# Altium project IDC_Tester_v1.PrjPcb (part 1 of 3)
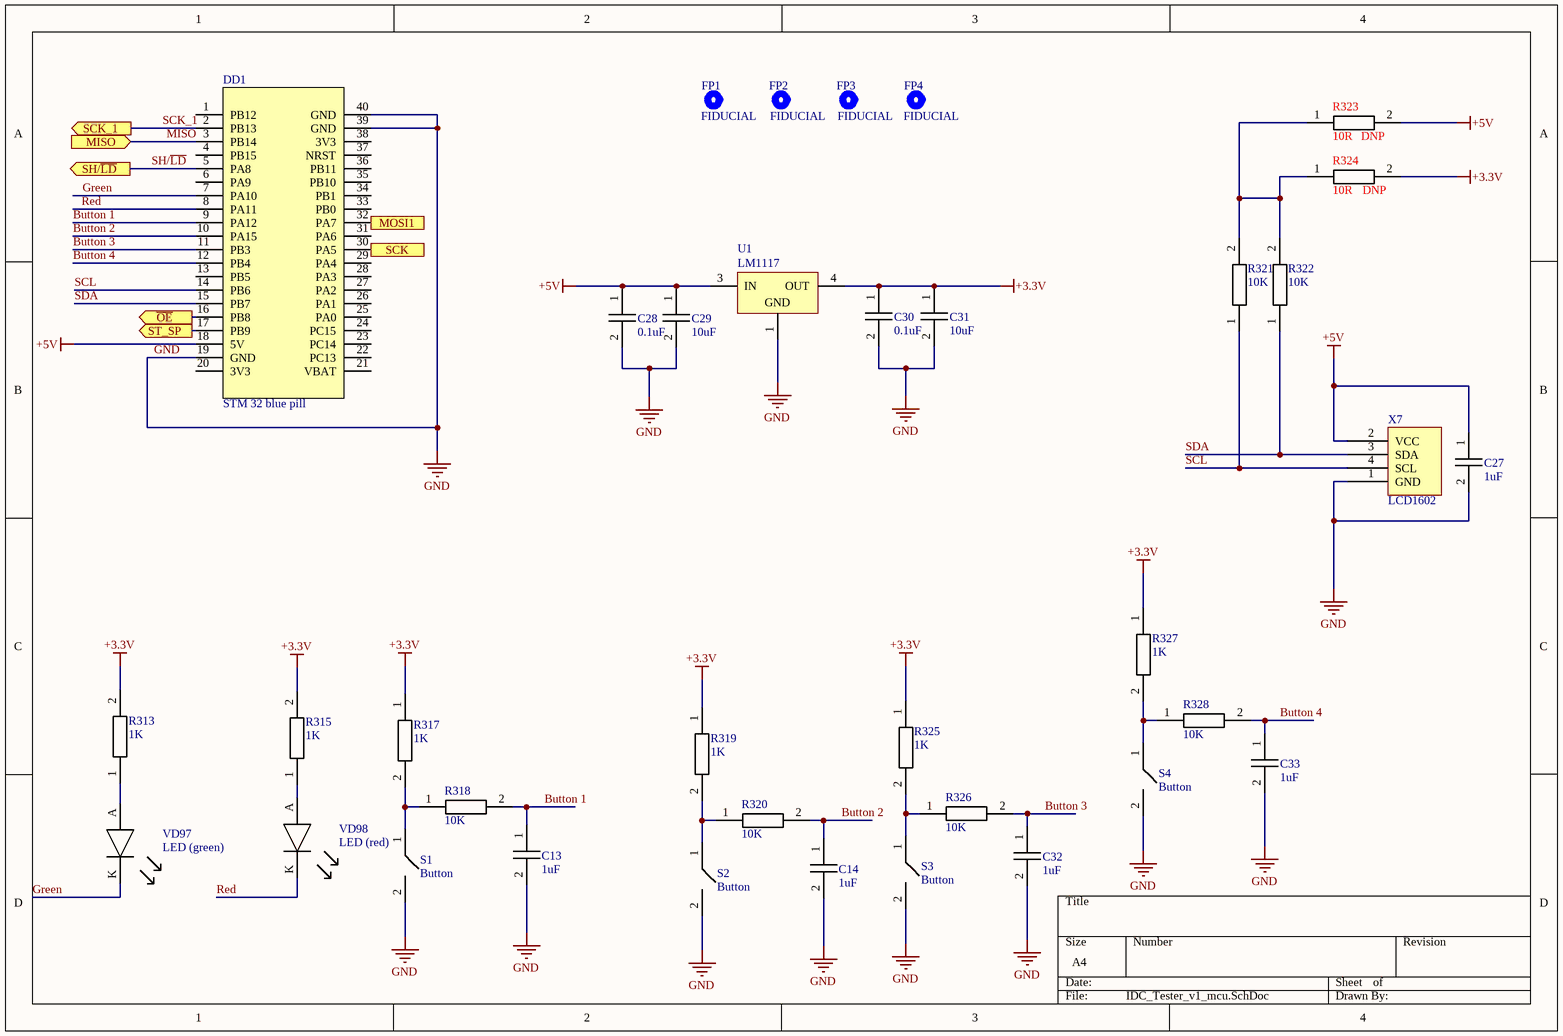
[diagram p0: IDC_Tester_v1_mcu.SchDoc]
10 sheets, 594 parts. Net scope: flat (ports and power ports of the same name join across sheets).
Board file: IDC_Tester_v1.PcbDoc
Sheets:
  IDC_Tester_v1_mcu.SchDoc
  IDC_Tester_v1_sift_register_output.SchDoc
  IDC_Tester_v1_connector.SchDoc
  IDC_Tester_v1_LED.SchDoc
  IDC_Tester_v1_LED_2.SchDoc
  IDC_Tester_v1_LED_3.SchDoc
  IDC_Tester_v1_LED_4.SchDoc
  IDC_Tester_v1_LED_5.SchDoc
  IDC_Tester_v1_LED_6.SchDoc
  IDC_Tester_v1_sift_register_input.SchDoc

## Sheet IDC_Tester_v1_mcu.SchDoc
size A4; SheetNumber: 1; SheetTotal: 10

### Parts
C13  1uF  [Capacitor 0603]
C14  1uF  [Capacitor 0603]
C27  1uF  [Capacitor 0603]
C28  0.1uF  [Capacitor 0603]
C29  10uF  [Capacitor 0603]
C30  0.1uF  [Capacitor 0603]
C31  10uF  [Capacitor 0603]
C32  1uF  [Capacitor 0603]
C33  1uF  [Capacitor 0603]
DD1  STM 32 blue pill  [STM32 blue pill]
FP1  FIDUCIAL  [FIDICIAL POINT - R0.3]
FP2  FIDUCIAL  [FIDICIAL POINT - R0.3]
FP3  FIDUCIAL  [FIDICIAL POINT - R0.3]
FP4  FIDUCIAL  [FIDICIAL POINT - R0.3]
R313  1K  [Resistor 0603]
R315  1K  [Resistor 0603]
R317  1K  [Resistor 0603]
R318  10K  [Resistor 0603]
R319  1K  [Resistor 0603]
R320  10K  [Resistor 0603]
R321  10K  [Resistor 0603]
R322  10K  [Resistor 0603]
R323  10R  Mount: DNP  [Resistor 0603]
R324  10R  Mount: DNP  [Resistor 0603]
R325  1K  [Resistor 0603]
R326  10K  [Resistor 0603]
R327  1K  [Resistor 0603]
R328  10K  [Resistor 0603]
S1  Button  [Button]
S2  Button  [Button]
S3  Button  [Button]
S4  Button  [Button]
U1  LM1117  [TO-252]
VD97  LED (green)  [Led 0603 green]
VD98  LED (red)  [Led 0603 RED]
X7  LCD1602  [LCD1602]

### Ports
MISO (in), MOSI1 (out), SCK (out), SCK_1 (out), SH/~{LD} (out), ST_SP (out), ~{OE} (out)

### Nets
+3.3V: C30.1 C31.1 R313.2 R315.2 R317.1 R319.1 R324.2 R325.1 R327.1 U1.4(OUT)
+5V: C27.1 C28.1 C29.1 DD1.18(5V) R323.2 U1.3(IN) X7.2(VCC)
GND: C13.2 C14.2 C27.2 C28.2 C29.2 C30.2 C31.2 C32.2 C33.2 DD1.19(GND) DD1.39(GND) DD1.40(GND) S1.2 S2.2 S3.2 S4.2 U1.1(GND) X7.1(GND)
Button 1: C13.1 DD1.9(PA12) R318.2
Button 2: C14.1 DD1.10(PA15) R320.2
Button 3: C32.1 DD1.11(PB3) R326.2
Button 4: C33.1 DD1.12(PB4) R328.2
Green: DD1.7(PA10) VD97.K
MISO: DD1.3(PB14) ; port MISO
MOSI 1: DD1.32(PA7) ; port MOSI1
~{OE}: DD1.16(PB8) ; port ~{OE}
Red: DD1.8(PA11) VD98.K
SCK: DD1.30(PA5) ; port SCK
SCK_1: DD1.2(PB13) ; port SCK_1
SCL: DD1.14(PB6) R321.1 X7.4(SCL)
SDA: DD1.15(PB7) R322.1 X7.3(SDA)
SH/~{LD}: DD1.5(PA8) ; port SH/~{LD}
ST_CP: DD1.17(PB9) ; port ST_SP
NetR313_1: R313.1 VD97.A
NetR315_1: R315.1 VD98.A
NetR317_2: R317.2 R318.1 S1.1
NetR319_2: R319.2 R320.1 S2.1
NetR321_2: R321.2 R322.2 R323.1 R324.1
NetR325_2: R325.2 R326.1 S3.1
NetR327_2: R327.2 R328.1 S4.1

Not connected (* = marked no-connect by the designer): DD1 1(PB12) 4(PB15) 6(PA9) 13(PB5) 20(3V3) 21(VBAT) 22(PC13) 23(PC14) 24(PC15) 25(PA0) 26(PA1) 27(PA2) 28(PA3) 29(PA4) 31(PA6) 33(PB0) 34(PB1) 35(PB10) 36(PB11) 37(NRST) 38(3V3)

### Library data of the parts
C13 C14 C27 C32 C33 = Capacitor: Part Number: SMD CAP CER 1UF 25V X5R 0603 (CC0603KRX5R8BB105); Added by: viskov2055@gmail.com; Mount_Type: SMD; Solder_Amount: 2; Pkg: 0603; Created at: 16/02/2024; Mount: MOUNT
C28 C30 = C0603_2: Capacitor SMD 0603; Part Number: CAP CER 0603 0.1uF 16V 10%; Added_by: ridel_av@teslatec.ru; Solder_Amount: 2; Pkg: 0603; Mount: MOUNT; MountType: SMD
C29 C31 = C0603_3: Capacitor SMD 0603; Part Number: CAP CER 0603 10uF 16V 10%; Added_by: ridel_av@teslatec.ru; Solder_Amount: 2; Pkg: 0603; Mount: MOUNT; MountType: SMD
DD1 = STM 32 blue pill: Part Number: STM32F103C8T6 (blue pill); Added by: viskov2055@gmail.com; Mount_Type: THM; Solder_Amount: 40; Pkg: PBS-40 (STM32 blue pill); Created at: 13/02/2024; Mount: MOUNT
FP1-FP4 = FIDUCIAL_R0.3: Adder_by: ridel_av@teslatec.ru; Solder_Amount: -; Pkg: -; Created_at: 22/03/2020; Mount: -; MountType: -
R313 R315 R317 R319 R325 R327 = Resistor 1K: Part Number: SMD RES 1K OHM 1%±100ppm/°C 0603 (RMCF0603FT1K00); Added by: viskov2055@gmail.com; Mount_Type: SMD; Solder_Amount: 2; Pkg: 0603; Created at: 13/02/2024; Mount: MOUNT
R318 R320-R322 R326 R328 = Resistor 10K: Part Number: SMD RES 10K OHM 1%±100ppm/°C 0603 (RMCF0603FT10K0); Added by: viskov2055@gmail.com; Mount_Type: SMD; Solder_Amount: 2; Pkg: 0603; Created at: 15/02/2024; Mount: MOUNT
R323 R324 = Resistor 10R: Part Number: SMD RES 10 OHM 1% ±100ppm/°C 0603 (RMCF0603FT10R); Added by: viskov2055@gmail.com; Mount_Type: SMD; Solder_Amount: 2; Pkg: 0603; Created at: 19/02/2024
S1-S4 = Button: Part Number: PTS645SM43SMTR92LFS; Added by: viskov2055@gmail.com; Mpunt_Type: SMD; Solder_Amount: 4; Created at: 19/02/2024; Mount: MOUNT; Pkg: Button
U1 = LM1117DT-3.3/NOPB: 800mA Low-Dropout Linear Regulator, 3-pin TO-252, Pb-Free; Added_by: ridel_av@teslatec.ru; Solder_Amount: 3; Pkg: TD03B_N; Mount: MOUNT; MountType: SMD; Part Number: LM1117DT-3.3/NOPB
VD97 = LED: LED Uni-Color Green 515nm 2-Pin SMD T/R; Manufacturer: Kingbright; Manufacturer Part Number: APG1608ZGCK; Lens Style: Flat; Lens Transparency: Clear; Luminous Intensity: 400mcd; Forward Voltage: 3.3V; Test Current: 20mA; Viewing Angle: 130°; Dominant Wavelength: 525nm; Lens Size: 0.8mm; Added by: viskov2055@gmail.com; Solder_Amount: 2; Pkg: 0603; RoHS: Yes; Category: LEDs; Stock 1: 44996; Pricing 1: 1=0,6, 10=0,368, 100=0,2114, 1000=0,16544, 2000=0,15165 (USD); MountType: SMD; Case/Package: 0603; Color: Green; Case Code (Imperial): 0603; Case Code (Metric): 1608; Packaging: Tape and Reel; Length: 1.6mm; Width: 0.8mm; Height: 0.28mm; RoHS Compliant: Yes; ComponentLink1URL: https://datasheet.octopart.com/APG1608ZGCK-Kingbright-datasheet-153682089.pdf?src-supplier=Future+Electronics; ComponentLink1Description: https://datasheet.octopart.com/APG1608ZGCK-Kingbright-datasheet-153682089.pdf?src-supplier=Future+Electronics; ComponentLink2URL: http://www.kingbrightusa.com/images/catalog/SPEC/APG1608ZGCK.pdf?src-supplier=Digikey; ComponentLink2Description: http://www.kingbrightusa.com/images/catalog/SPEC/APG1608ZGCK.pdf?src-supplier=Digikey; ComponentLink3URL: https://datasheet.octopart.com/APG1608ZGCK-Kingbright-datasheet-137408059.pdf?src-supplier=Sager+Electronics; ComponentLink3Description: https://datasheet.octopart.com/APG1608ZGCK-Kingbright-datasheet-137408059.pdf?src-supplier=Sager+Electronics; Supplier Part Number 1: 754-2113-1-ND; Created at: 13/02/2024; Mount: MOUNT; Part Number: APG1608ZGCK; Supplier 1: Digikey
VD98 = LED (red): Part Number: APT1608SURCK; Added by: viskov2055@gmail.com; Solder_Amount: 2; Pkg: 0603; Mount_Type: SMD; Created at: 13/02/2024; Mount: MOUNT
X7 = LCD1602: Part Number: LCD1602I2C (green light); Added by: viskov2055@gmail.com; Mount_Type: THM; Solder_Amount: 4; Pkg: board (connector); Created at: 19/02/2024; Mount: MOUNT

## Sheet IDC_Tester_v1_sift_register_output.SchDoc
size 420 x 297 mm; SheetNumber: 2; SheetTotal: 10
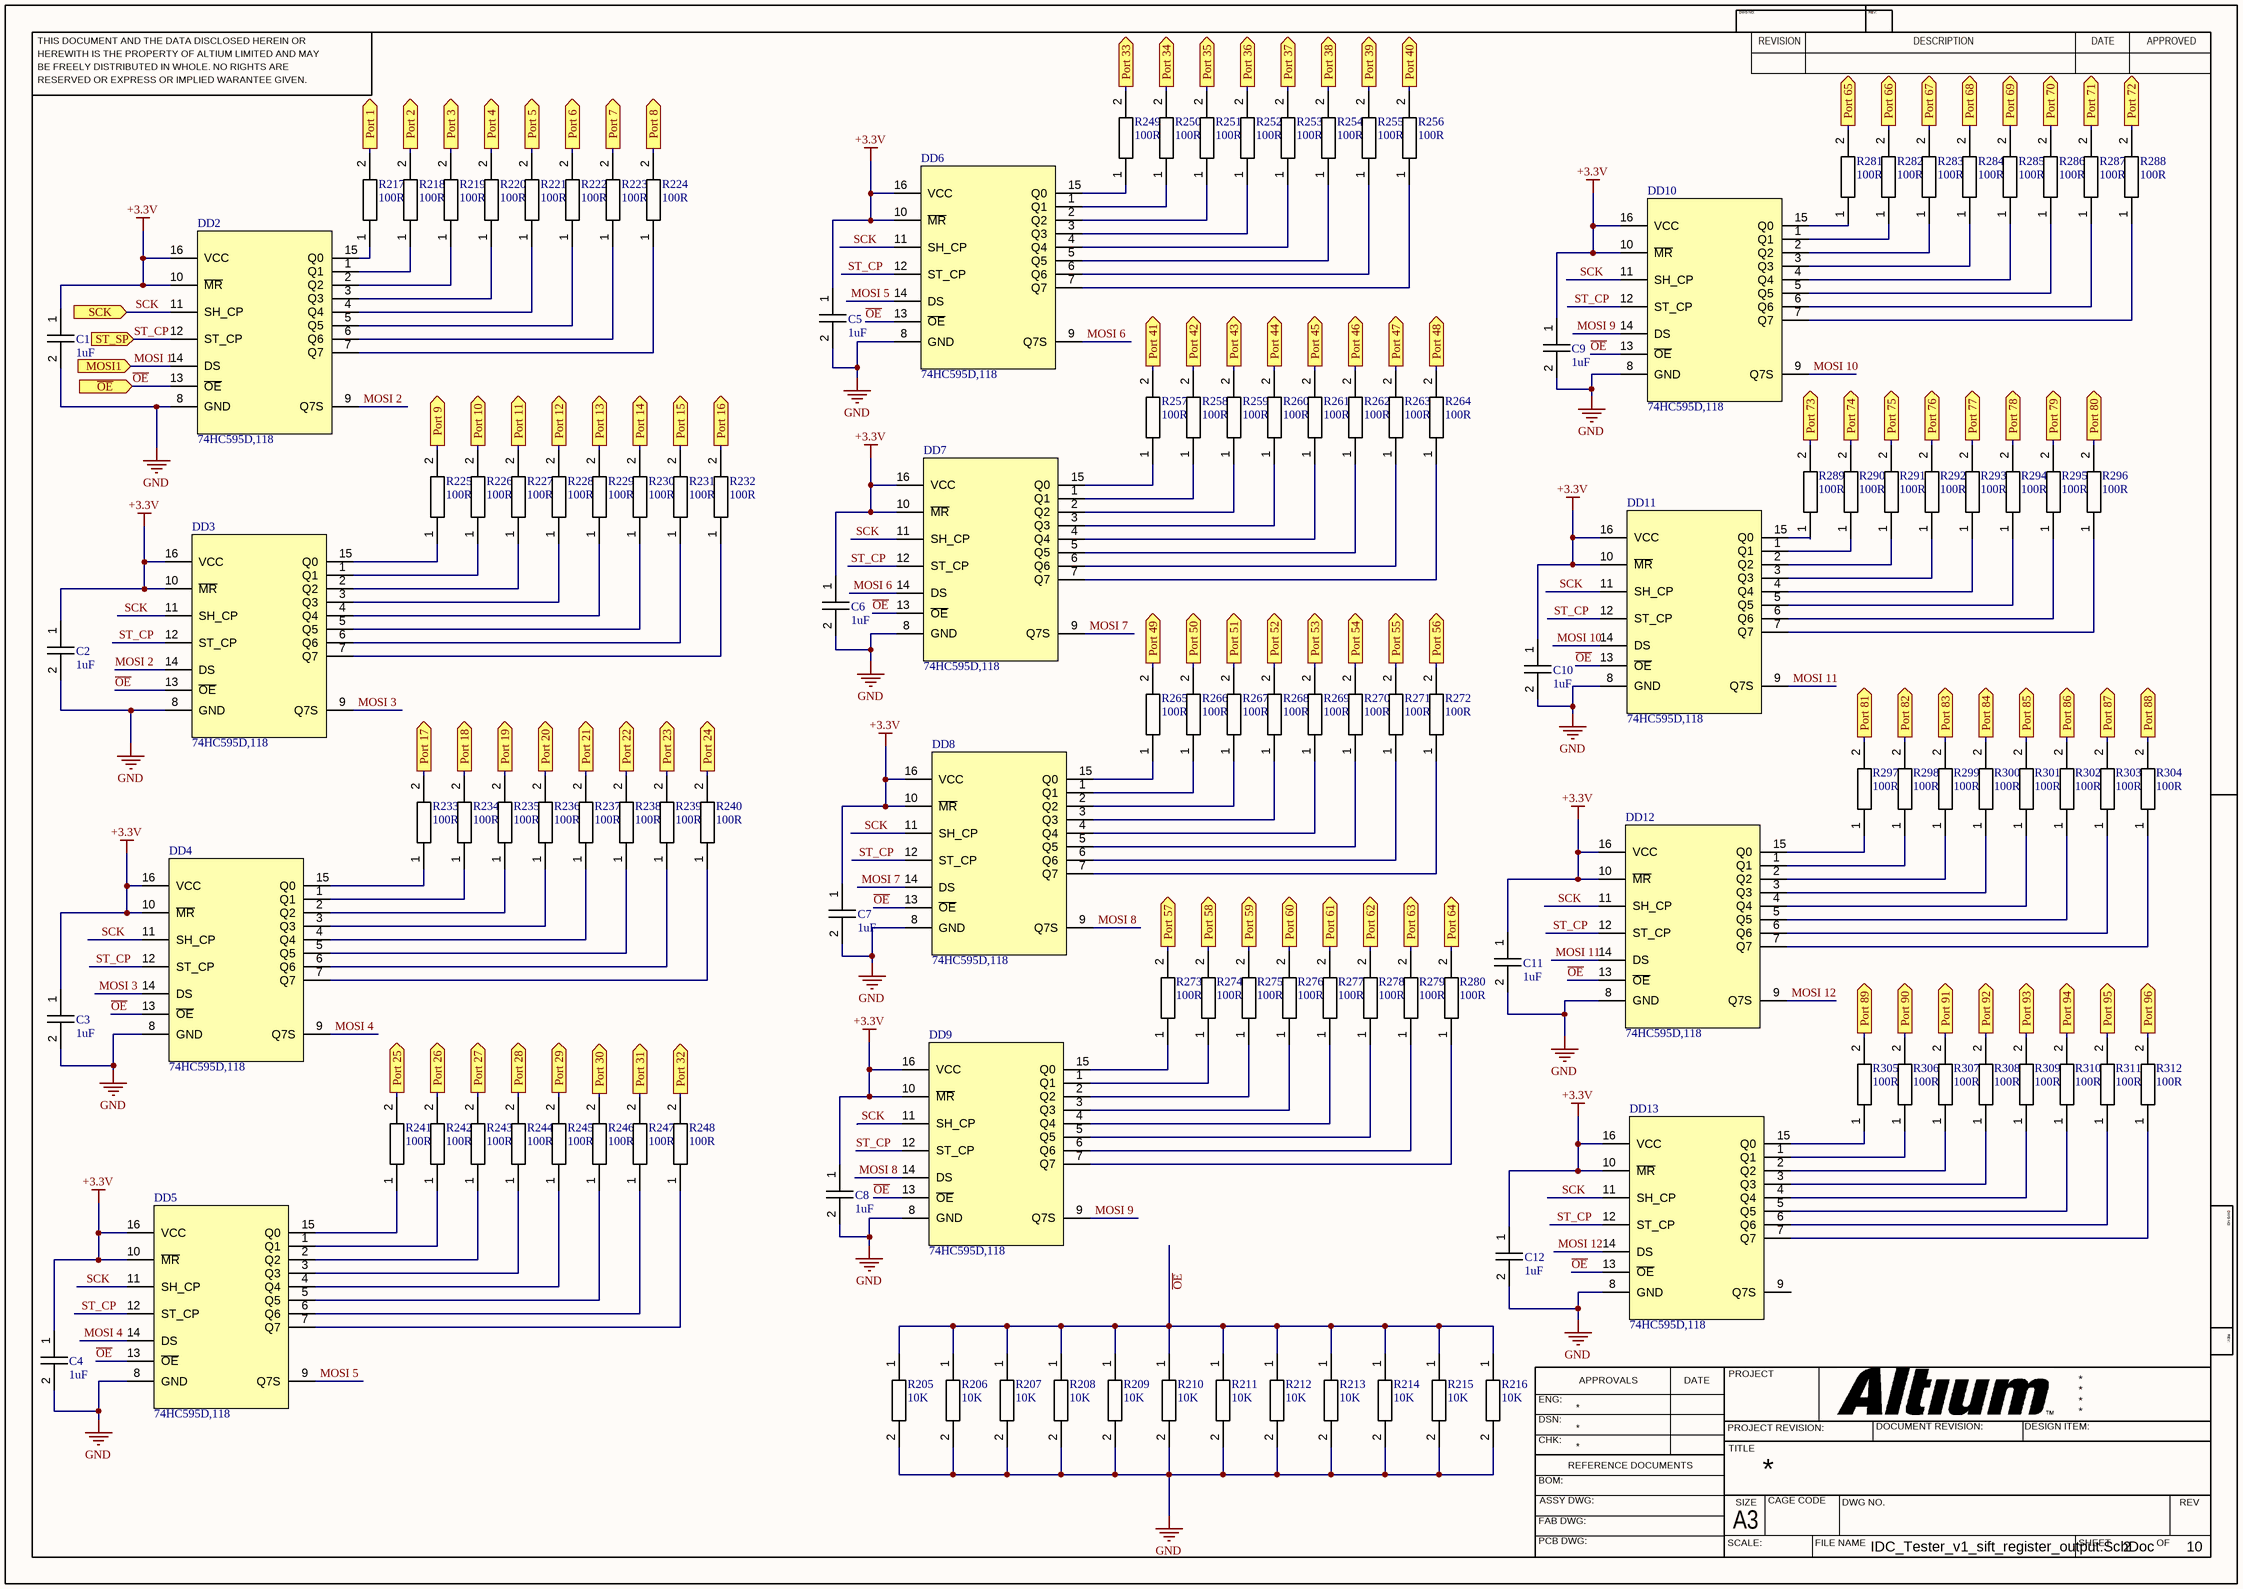
[diagram p1: IDC_Tester_v1_sift_register_output.SchDoc]

### Parts
C1  1uF  [Capacitor 0603]
C2  1uF  [Capacitor 0603]
C3  1uF  [Capacitor 0603]
C4  1uF  [Capacitor 0603]
C5  1uF  [Capacitor 0603]
C6  1uF  [Capacitor 0603]
C7  1uF  [Capacitor 0603]
C8  1uF  [Capacitor 0603]
C9  1uF  [Capacitor 0603]
C10  1uF  [Capacitor 0603]
C11  1uF  [Capacitor 0603]
C12  1uF  [Capacitor 0603]
DD2  74HC595D,118  [Shift register 74HC165 or 74HC595]
DD3  74HC595D,118  [Shift register 74HC165 or 74HC595]
DD4  74HC595D,118  [Shift register 74HC165 or 74HC595]
DD5  74HC595D,118  [Shift register 74HC165 or 74HC595]
DD6  74HC595D,118  [Shift register 74HC165 or 74HC595]
DD7  74HC595D,118  [Shift register 74HC165 or 74HC595]
DD8  74HC595D,118  [Shift register 74HC165 or 74HC595]
DD9  74HC595D,118  [Shift register 74HC165 or 74HC595]
DD10  74HC595D,118  [Shift register 74HC165 or 74HC595]
DD11  74HC595D,118  [Shift register 74HC165 or 74HC595]
DD12  74HC595D,118  [Shift register 74HC165 or 74HC595]
DD13  74HC595D,118  [Shift register 74HC165 or 74HC595]
R205  10K  [Resistor 0603]
R206  10K  [Resistor 0603]
R207  10K  [Resistor 0603]
R208  10K  [Resistor 0603]
R209  10K  [Resistor 0603]
R210  10K  [Resistor 0603]
R211  10K  [Resistor 0603]
R212  10K  [Resistor 0603]
R213  10K  [Resistor 0603]
R214  10K  [Resistor 0603]
R215  10K  [Resistor 0603]
R216  10K  [Resistor 0603]
R217  100R  [Resistor 0603]
R218  100R  [Resistor 0603]
R219  100R  [Resistor 0603]
R220  100R  [Resistor 0603]
R221  100R  [Resistor 0603]
R222  100R  [Resistor 0603]
R223  100R  [Resistor 0603]
R224  100R  [Resistor 0603]
R225  100R  [Resistor 0603]
R226  100R  [Resistor 0603]
R227  100R  [Resistor 0603]
R228  100R  [Resistor 0603]
R229  100R  [Resistor 0603]
R230  100R  [Resistor 0603]
R231  100R  [Resistor 0603]
R232  100R  [Resistor 0603]
R233  100R  [Resistor 0603]
R234  100R  [Resistor 0603]
R235  100R  [Resistor 0603]
R236  100R  [Resistor 0603]
R237  100R  [Resistor 0603]
R238  100R  [Resistor 0603]
R239  100R  [Resistor 0603]
R240  100R  [Resistor 0603]
R241  100R  [Resistor 0603]
R242  100R  [Resistor 0603]
R243  100R  [Resistor 0603]
R244  100R  [Resistor 0603]
R245  100R  [Resistor 0603]
R246  100R  [Resistor 0603]
R247  100R  [Resistor 0603]
R248  100R  [Resistor 0603]
R249  100R  [Resistor 0603]
R250  100R  [Resistor 0603]
R251  100R  [Resistor 0603]
R252  100R  [Resistor 0603]
R253  100R  [Resistor 0603]
R254  100R  [Resistor 0603]
R255  100R  [Resistor 0603]
R256  100R  [Resistor 0603]
R257  100R  [Resistor 0603]
R258  100R  [Resistor 0603]
R259  100R  [Resistor 0603]
R260  100R  [Resistor 0603]
R261  100R  [Resistor 0603]
R262  100R  [Resistor 0603]
R263  100R  [Resistor 0603]
R264  100R  [Resistor 0603]
R265  100R  [Resistor 0603]
R266  100R  [Resistor 0603]
R267  100R  [Resistor 0603]
R268  100R  [Resistor 0603]
R269  100R  [Resistor 0603]
R270  100R  [Resistor 0603]
R271  100R  [Resistor 0603]
R272  100R  [Resistor 0603]
R273  100R  [Resistor 0603]
R274  100R  [Resistor 0603]
R275  100R  [Resistor 0603]
R276  100R  [Resistor 0603]
R277  100R  [Resistor 0603]
R278  100R  [Resistor 0603]
R279  100R  [Resistor 0603]
R280  100R  [Resistor 0603]
R281  100R  [Resistor 0603]
R282  100R  [Resistor 0603]
R283  100R  [Resistor 0603]
R284  100R  [Resistor 0603]
R285  100R  [Resistor 0603]
R286  100R  [Resistor 0603]
R287  100R  [Resistor 0603]
R288  100R  [Resistor 0603]
R289  100R  [Resistor 0603]
R290  100R  [Resistor 0603]
R291  100R  [Resistor 0603]
R292  100R  [Resistor 0603]
R293  100R  [Resistor 0603]
R294  100R  [Resistor 0603]
R295  100R  [Resistor 0603]
R296  100R  [Resistor 0603]
R297  100R  [Resistor 0603]
R298  100R  [Resistor 0603]
R299  100R  [Resistor 0603]
R300  100R  [Resistor 0603]
R301  100R  [Resistor 0603]
R302  100R  [Resistor 0603]
R303  100R  [Resistor 0603]
R304  100R  [Resistor 0603]
R305  100R  [Resistor 0603]
R306  100R  [Resistor 0603]
R307  100R  [Resistor 0603]
R308  100R  [Resistor 0603]
R309  100R  [Resistor 0603]
R310  100R  [Resistor 0603]
R311  100R  [Resistor 0603]
R312  100R  [Resistor 0603]

### Ports
MOSI1 (in), Port 1 (out), Port 2 (out), Port 3 (out), Port 4 (out), Port 5 (out), Port 6 (out), Port 7 (out), Port 8 (out), Port 9 (out), Port 10 (out), Port 11 (out), Port 12 (out), Port 13 (out), Port 14 (out), Port 15 (out), Port 16 (out), Port 17 (out), Port 18 (out), Port 19 (out), Port 20 (out), Port 21 (out), Port 22 (out), Port 23 (out), Port 24 (out), Port 25 (out), Port 26 (out), Port 27 (out), Port 28 (out), Port 29 (out), Port 30 (out), Port 31 (out), Port 32 (out), Port 33 (out), Port 34 (out), Port 35 (out), Port 36 (out), Port 37 (out), Port 38 (out), Port 39 (out), Port 40 (out), Port 41 (out), Port 42 (out), Port 43 (out), Port 44 (out), Port 45 (out), Port 46 (out), Port 47 (out), Port 48 (out), Port 49 (out), Port 50 (out), Port 51 (out), Port 52 (out), Port 53 (out), Port 54 (out), Port 55 (out), Port 56 (out), Port 57 (out), Port 58 (out), Port 59 (out), Port 60 (out), Port 61 (out), Port 62 (out), Port 63 (out), Port 64 (out), Port 65 (out), Port 66 (out), Port 67 (out), Port 68 (out), Port 69 (out), Port 70 (out), Port 71 (out), Port 72 (out), Port 73 (out), Port 74 (out), Port 75 (out), Port 76 (out), Port 77 (out), Port 78 (out), Port 79 (out), Port 80 (out), Port 81 (out), Port 82 (out), Port 83 (out), Port 84 (out), Port 85 (out), Port 86 (out), Port 87 (out), Port 88 (out), Port 89 (out), Port 90 (out), Port 91 (out), Port 92 (out), Port 93 (out), Port 94 (out), Port 95 (out), Port 96 (out), SCK (in), ST_SP (in), ~{OE} (in)

### Nets
+3.3V: C1.1 C2.1 C3.1 C4.1 C5.1 C6.1 C7.1 C8.1 C9.1 C10.1 C11.1 C12.1 DD2.10(~{MR}) DD2.16(VCC) DD3.10(~{MR}) DD3.16(VCC) DD4.10(~{MR}) DD4.16(VCC) DD5.10(~{MR}) DD5.16(VCC) DD6.10(~{MR}) DD6.16(VCC) DD7.10(~{MR}) DD7.16(VCC) DD8.10(~{MR}) DD8.16(VCC) DD9.10(~{MR}) DD9.16(VCC) DD10.10(~{MR}) DD10.16(VCC) DD11.10(~{MR}) DD11.16(VCC) DD12.10(~{MR}) DD12.16(VCC) DD13.10(~{MR}) DD13.16(VCC)
GND: C1.2 C2.2 C3.2 C4.2 C5.2 C6.2 C7.2 C8.2 C9.2 C10.2 C11.2 C12.2 DD2.8(GND) DD3.8(GND) DD4.8(GND) DD5.8(GND) DD6.8(GND) DD7.8(GND) DD8.8(GND) DD9.8(GND) DD10.8(GND) DD11.8(GND) DD12.8(GND) DD13.8(GND) R205.2 R206.2 R207.2 R208.2 R209.2 R210.2 R211.2 R212.2 R213.2 R214.2 R215.2 R216.2
MOSI 1: DD2.14(DS) ; port MOSI1
MOSI 2: DD2.9(Q7S) DD3.14(DS)
MOSI 3: DD3.9(Q7S) DD4.14(DS)
MOSI 4: DD4.9(Q7S) DD5.14(DS)
MOSI 5: DD5.9(Q7S) DD6.14(DS)
MOSI 6: DD6.9(Q7S) DD7.14(DS)
MOSI 7: DD7.9(Q7S) DD8.14(DS)
MOSI 8: DD8.9(Q7S) DD9.14(DS)
MOSI 9: DD9.9(Q7S) DD10.14(DS)
MOSI 10: DD10.9(Q7S) DD11.14(DS)
MOSI 11: DD11.9(Q7S) DD12.14(DS)
MOSI 12: DD12.9(Q7S) DD13.14(DS)
~{OE}: DD2.13(~{OE}) DD3.13(~{OE}) DD4.13(~{OE}) DD5.13(~{OE}) DD6.13(~{OE}) DD7.13(~{OE}) DD8.13(~{OE}) DD9.13(~{OE}) DD10.13(~{OE}) DD11.13(~{OE}) DD12.13(~{OE}) DD13.13(~{OE}) R205.1 R206.1 R207.1 R208.1 R209.1 R210.1 R211.1 R212.1 R213.1 R214.1 R215.1 R216.1 ; port ~{OE}
SCK: DD2.11(SH_CP) DD3.11(SH_CP) DD4.11(SH_CP) DD5.11(SH_CP) DD6.11(SH_CP) DD7.11(SH_CP) DD8.11(SH_CP) DD9.11(SH_CP) DD10.11(SH_CP) DD11.11(SH_CP) DD12.11(SH_CP) DD13.11(SH_CP) ; port SCK
ST_CP: DD2.12(ST_CP) DD3.12(ST_CP) DD4.12(ST_CP) DD5.12(ST_CP) DD6.12(ST_CP) DD7.12(ST_CP) DD8.12(ST_CP) DD9.12(ST_CP) DD10.12(ST_CP) DD11.12(ST_CP) DD12.12(ST_CP) DD13.12(ST_CP) ; port ST_SP
NetDD2_1: DD2.1(Q1) R218.1
NetDD2_2: DD2.2(Q2) R219.1
NetDD2_3: DD2.3(Q3) R220.1
NetDD2_4: DD2.4(Q4) R221.1
NetDD2_5: DD2.5(Q5) R222.1
NetDD2_6: DD2.6(Q6) R223.1
NetDD2_7: DD2.7(Q7) R224.1
NetDD2_15: DD2.15(Q0) R217.1
NetDD3_1: DD3.1(Q1) R226.1
NetDD3_2: DD3.2(Q2) R227.1
NetDD3_3: DD3.3(Q3) R228.1
NetDD3_4: DD3.4(Q4) R229.1
NetDD3_5: DD3.5(Q5) R230.1
NetDD3_6: DD3.6(Q6) R231.1
NetDD3_7: DD3.7(Q7) R232.1
NetDD3_15: DD3.15(Q0) R225.1
NetDD4_1: DD4.1(Q1) R234.1
NetDD4_2: DD4.2(Q2) R235.1
NetDD4_3: DD4.3(Q3) R236.1
NetDD4_4: DD4.4(Q4) R237.1
NetDD4_5: DD4.5(Q5) R238.1
NetDD4_6: DD4.6(Q6) R239.1
NetDD4_7: DD4.7(Q7) R240.1
NetDD4_15: DD4.15(Q0) R233.1
NetDD5_1: DD5.1(Q1) R242.1
NetDD5_2: DD5.2(Q2) R243.1
NetDD5_3: DD5.3(Q3) R244.1
NetDD5_4: DD5.4(Q4) R245.1
NetDD5_5: DD5.5(Q5) R246.1
NetDD5_6: DD5.6(Q6) R247.1
NetDD5_7: DD5.7(Q7) R248.1
NetDD5_15: DD5.15(Q0) R241.1
NetDD6_1: DD6.1(Q1) R250.1
NetDD6_2: DD6.2(Q2) R251.1
NetDD6_3: DD6.3(Q3) R252.1
NetDD6_4: DD6.4(Q4) R253.1
NetDD6_5: DD6.5(Q5) R254.1
NetDD6_6: DD6.6(Q6) R255.1
NetDD6_7: DD6.7(Q7) R256.1
NetDD6_15: DD6.15(Q0) R249.1
NetDD7_1: DD7.1(Q1) R258.1
NetDD7_2: DD7.2(Q2) R259.1
NetDD7_3: DD7.3(Q3) R260.1
NetDD7_4: DD7.4(Q4) R261.1
NetDD7_5: DD7.5(Q5) R262.1
NetDD7_6: DD7.6(Q6) R263.1
NetDD7_7: DD7.7(Q7) R264.1
NetDD7_15: DD7.15(Q0) R257.1
NetDD8_1: DD8.1(Q1) R266.1
NetDD8_2: DD8.2(Q2) R267.1
NetDD8_3: DD8.3(Q3) R268.1
NetDD8_4: DD8.4(Q4) R269.1
NetDD8_5: DD8.5(Q5) R270.1
NetDD8_6: DD8.6(Q6) R271.1
NetDD8_7: DD8.7(Q7) R272.1
NetDD8_15: DD8.15(Q0) R265.1
NetDD9_1: DD9.1(Q1) R274.1
NetDD9_2: DD9.2(Q2) R275.1
NetDD9_3: DD9.3(Q3) R276.1
NetDD9_4: DD9.4(Q4) R277.1
NetDD9_5: DD9.5(Q5) R278.1
NetDD9_6: DD9.6(Q6) R279.1
NetDD9_7: DD9.7(Q7) R280.1
NetDD9_15: DD9.15(Q0) R273.1
NetDD10_1: DD10.1(Q1) R282.1
NetDD10_2: DD10.2(Q2) R283.1
NetDD10_3: DD10.3(Q3) R284.1
NetDD10_4: DD10.4(Q4) R285.1
NetDD10_5: DD10.5(Q5) R286.1
NetDD10_6: DD10.6(Q6) R287.1
NetDD10_7: DD10.7(Q7) R288.1
NetDD10_15: DD10.15(Q0) R281.1
NetDD11_1: DD11.1(Q1) R290.1
NetDD11_2: DD11.2(Q2) R291.1
NetDD11_3: DD11.3(Q3) R292.1
NetDD11_4: DD11.4(Q4) R293.1
NetDD11_5: DD11.5(Q5) R294.1
NetDD11_6: DD11.6(Q6) R295.1
NetDD11_7: DD11.7(Q7) R296.1
NetDD11_15: DD11.15(Q0) R289.1
NetDD12_1: DD12.1(Q1) R298.1
NetDD12_2: DD12.2(Q2) R299.1
NetDD12_3: DD12.3(Q3) R300.1
NetDD12_4: DD12.4(Q4) R301.1
NetDD12_5: DD12.5(Q5) R302.1
NetDD12_6: DD12.6(Q6) R303.1
NetDD12_7: DD12.7(Q7) R304.1
NetDD12_15: DD12.15(Q0) R297.1
NetDD13_1: DD13.1(Q1) R306.1
NetDD13_2: DD13.2(Q2) R307.1
NetDD13_3: DD13.3(Q3) R308.1
NetDD13_4: DD13.4(Q4) R309.1
NetDD13_5: DD13.5(Q5) R310.1
NetDD13_6: DD13.6(Q6) R311.1
NetDD13_7: DD13.7(Q7) R312.1
NetDD13_15: DD13.15(Q0) R305.1
NetR217_2: R217.2 ; port Port 1
NetR218_2: R218.2 ; port Port 2
NetR219_2: R219.2 ; port Port 3
NetR220_2: R220.2 ; port Port 4
NetR221_2: R221.2 ; port Port 5
NetR222_2: R222.2 ; port Port 6
NetR223_2: R223.2 ; port Port 7
NetR224_2: R224.2 ; port Port 8
NetR225_2: R225.2 ; port Port 9
NetR226_2: R226.2 ; port Port 10
NetR227_2: R227.2 ; port Port 11
NetR228_2: R228.2 ; port Port 12
NetR229_2: R229.2 ; port Port 13
NetR230_2: R230.2 ; port Port 14
NetR231_2: R231.2 ; port Port 15
NetR232_2: R232.2 ; port Port 16
NetR233_2: R233.2 ; port Port 17
NetR234_2: R234.2 ; port Port 18
NetR235_2: R235.2 ; port Port 19
NetR236_2: R236.2 ; port Port 20
NetR237_2: R237.2 ; port Port 21
NetR238_2: R238.2 ; port Port 22
NetR239_2: R239.2 ; port Port 23
NetR240_2: R240.2 ; port Port 24
NetR241_2: R241.2 ; port Port 25
NetR242_2: R242.2 ; port Port 26
NetR243_2: R243.2 ; port Port 27
NetR244_2: R244.2 ; port Port 28
NetR245_2: R245.2 ; port Port 29
NetR246_2: R246.2 ; port Port 30
NetR247_2: R247.2 ; port Port 31
NetR248_2: R248.2 ; port Port 32
NetR249_2: R249.2 ; port Port 33
NetR250_2: R250.2 ; port Port 34
NetR251_2: R251.2 ; port Port 35
NetR252_2: R252.2 ; port Port 36
NetR253_2: R253.2 ; port Port 37
NetR254_2: R254.2 ; port Port 38
NetR255_2: R255.2 ; port Port 39
NetR256_2: R256.2 ; port Port 40
NetR257_2: R257.2 ; port Port 41
NetR258_2: R258.2 ; port Port 42
NetR259_2: R259.2 ; port Port 43
NetR260_2: R260.2 ; port Port 44
NetR261_2: R261.2 ; port Port 45
NetR262_2: R262.2 ; port Port 46
NetR263_2: R263.2 ; port Port 47
NetR264_2: R264.2 ; port Port 48
NetR265_2: R265.2 ; port Port 49
NetR266_2: R266.2 ; port Port 50
NetR267_2: R267.2 ; port Port 51
NetR268_2: R268.2 ; port Port 52
NetR269_2: R269.2 ; port Port 53
NetR270_2: R270.2 ; port Port 54
NetR271_2: R271.2 ; port Port 55
NetR272_2: R272.2 ; port Port 56
NetR273_2: R273.2 ; port Port 57
NetR274_2: R274.2 ; port Port 58
NetR275_2: R275.2 ; port Port 59
NetR276_2: R276.2 ; port Port 60
NetR277_2: R277.2 ; port Port 61
NetR278_2: R278.2 ; port Port 62
NetR279_2: R279.2 ; port Port 63
NetR280_2: R280.2 ; port Port 64
NetR281_2: R281.2 ; port Port 65
NetR282_2: R282.2 ; port Port 66
NetR283_2: R283.2 ; port Port 67
NetR284_2: R284.2 ; port Port 68
NetR285_2: R285.2 ; port Port 69
NetR286_2: R286.2 ; port Port 70
NetR287_2: R287.2 ; port Port 71
NetR288_2: R288.2 ; port Port 72
NetR289_2: R289.2 ; port Port 73
NetR290_2: R290.2 ; port Port 74
NetR291_2: R291.2 ; port Port 75
NetR292_2: R292.2 ; port Port 76
NetR293_2: R293.2 ; port Port 77
NetR294_2: R294.2 ; port Port 78
NetR295_2: R295.2 ; port Port 79
NetR296_2: R296.2 ; port Port 80
NetR297_2: R297.2 ; port Port 81
NetR298_2: R298.2 ; port Port 82
NetR299_2: R299.2 ; port Port 83
NetR300_2: R300.2 ; port Port 84
NetR301_2: R301.2 ; port Port 85
NetR302_2: R302.2 ; port Port 86
NetR303_2: R303.2 ; port Port 87
NetR304_2: R304.2 ; port Port 88
NetR305_2: R305.2 ; port Port 89
NetR306_2: R306.2 ; port Port 90
NetR307_2: R307.2 ; port Port 91
NetR308_2: R308.2 ; port Port 92
NetR309_2: R309.2 ; port Port 93
NetR310_2: R310.2 ; port Port 94
NetR311_2: R311.2 ; port Port 95
NetR312_2: R312.2 ; port Port 96

Not connected (* = marked no-connect by the designer): DD13 9(Q7S)

### Notes on the sheet
- THIS DOCUMENT AND THE DATA DISCLOSED HEREIN OR
- HEREWITH IS THE PROPERTY OF ALTIUM LIMITED AND MAY
- DWG NO:
- REVISION
- REV:
- DESCRIPTION
- DATE
- APPROVED
- BE FREELY DISTRIBUTED IN WHOLE. NO RIGHTS ARE
- RESERVED OR EXPRESS OR IMPLIED WARANTEE GIVEN.
- ENG:
- APPROVALS
- PROJECT
- DSN:
- CHK:
- REFERENCE DOCUMENTS
- PROJECT REVISION:
- TITLE
- DOCUMENT REVISION:
- DESIGN ITEM:
- BOM:
- FAB DWG:
- PCB DWG:
- ASSY DWG:
- SCALE:
- A3
- SIZE
- CAGE CODE
- FILE NAME
- DWG NO.
- SHEET
- OF
- REV

### Library data of the parts
C1-C12 = Capacitor: as C13 on sheet IDC_Tester_v1_mcu; Created at: 16/02/2024; Mount: MOUNT
DD2-DD13 = 74HC595D,118: 74HC Series 6 V 3-State Surface Mount Shift Register - SOIC-16; Manufacturer: Nexperia; Added by: viskov2055@gmail.com; Mount_Type: SMD; Solder_Amount: 16; Supplier 1: Rs; Manufacturer Part Number: 74HC595D,118; RoHS: Yes; Category: Shift Registers; Stock 1: 7500; Pricing 1: 2500=32,44, 5000=31,895 (RUB); ComponentLink1URL: http://www.farnell.com/datasheets/2038613.pdf?src-supplier=Farnell; ComponentLink1Description: http://www.farnell.com/datasheets/2038613.pdf?src-supplier=Farnell; ComponentLink2URL: https://assets.nexperia.com/documents/data-sheet/74HC_HCT595.pdf?src-supplier=Digikey; ComponentLink2Description: https://assets.nexperia.com/documents/data-sheet/74HC_HCT595.pdf?src-supplier=Digikey; ComponentLink3URL: https://datasheet.octopart.com/74HC595D%2C118-Nexperia-datasheet-62292421.pdf?src-supplier=Newark; ComponentLink3Description: https://datasheet.octopart.com/74HC595D%2C118-Nexperia-datasheet-62292421.pdf?src-supplier=Newark; ComponentLink4URL: http://www.farnell.com/datasheets/2038613.pdf?src-supplier=Newark; ComponentLink4Description: http://www.farnell.com/datasheets/2038613.pdf?src-supplier=Newark; ComponentLink5URL: http://www.farnell.com/datasheets/2038613.pdf?src-supplier=Element14; ComponentLink5Description: http://www.farnell.com/datasheets/2038613.pdf?src-supplier=Element14; ComponentLink6URL: https://datasheet.octopart.com/74HC595D%2C118-Nexperia-datasheet-11979826.pdf?src-supplier=Element14; ComponentLink6Description: https://datasheet.octopart.com/74HC595D%2C118-Nexperia-datasheet-11979826.pdf?src-supplier=Element14; Supplier Part Number 1: 1707956; Created at: 13/02/2024; Mount: MOUNT; Pkg: SOIC-16; Part Number: 74HC595D,118
R205-R216 = Resistor 10K: as R318 on sheet IDC_Tester_v1_mcu; Created at: 15/02/2024; Mount: MOUNT
R217-R312 = Resistor 100R: Part Number: SMD RES 100 OHM 1% ±100ppm/°C 0603 (RMCF0603FT100R); Added by: viskov2055@gmail.com; Mount_Type: SMD; Solder_Amount: 2; Pkg: 0603; Created at: 19/02/2024; Mount: MOUNT

## Sheet IDC_Tester_v1_connector.SchDoc
size A4; SheetNumber: 3; SheetTotal: 10
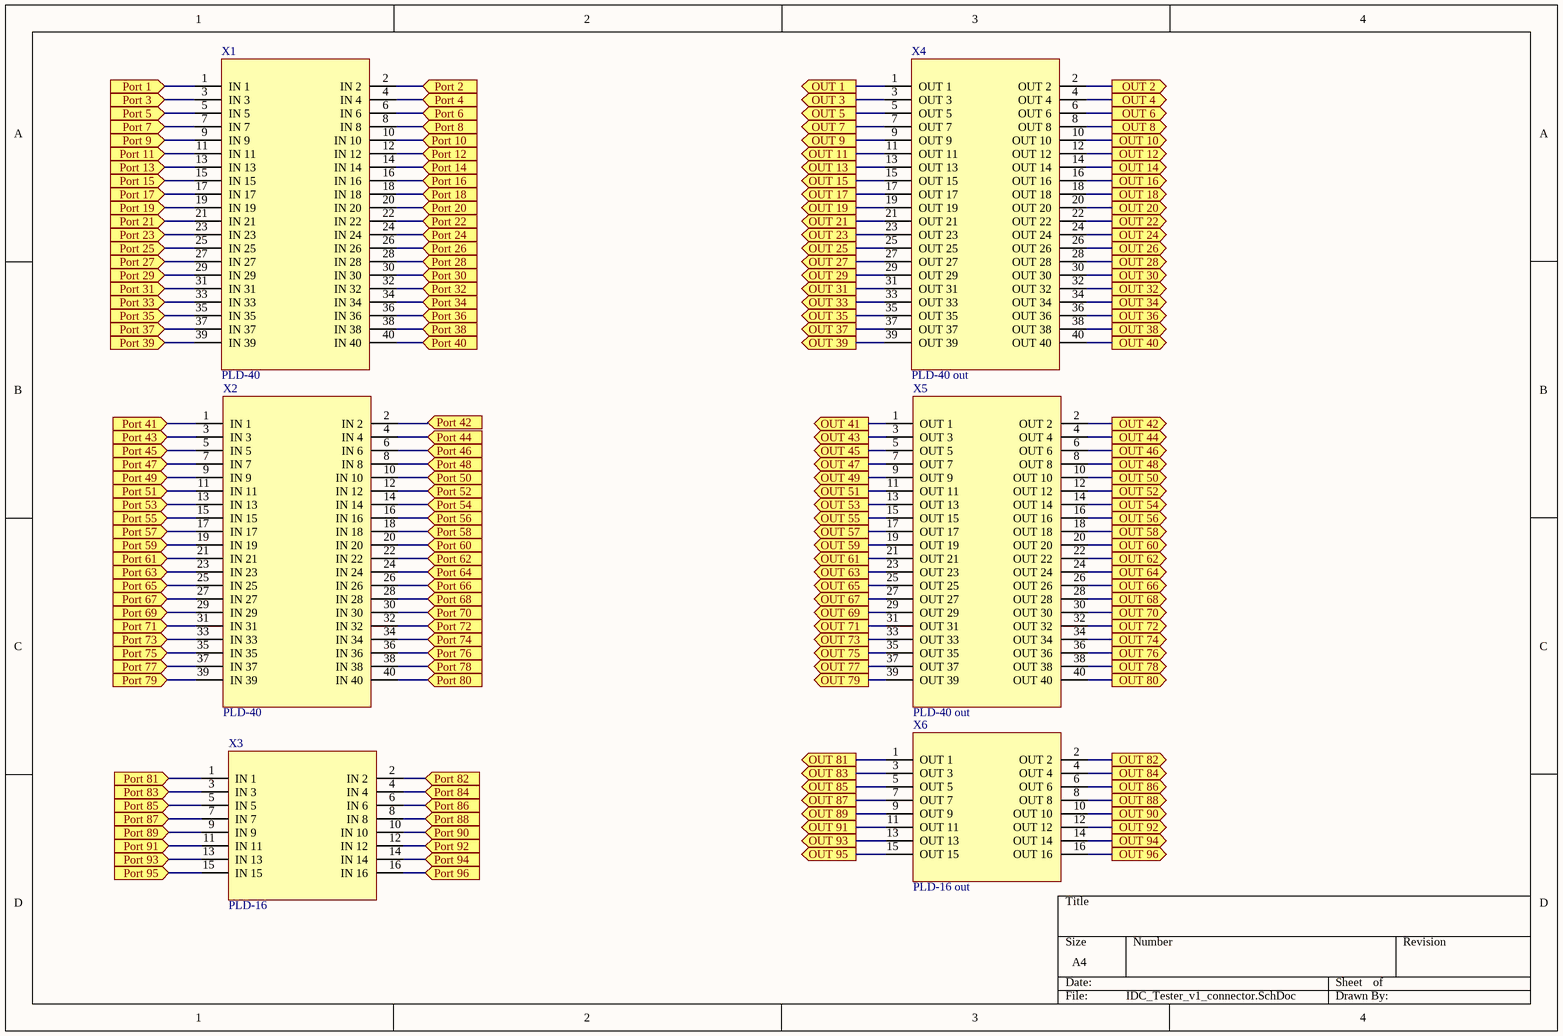
[diagram p2: IDC_Tester_v1_connector.SchDoc]

### Parts
X1  PLD-40  [PLD-40]
X2  PLD-40  [PLD-40]
X3  PLD-16  [PLD-16]
X4  PLD-40 out  [PLD-40]
X5  PLD-40 out  [PLD-40]
X6  PLD-16 out  [PLD-16]

### Ports
OUT 1 (out), OUT 2 (out), OUT 3 (out), OUT 4 (out), OUT 5 (out), OUT 6 (out), OUT 7 (out), OUT 8 (out), OUT 9 (out), OUT 10 (out), OUT 11 (out), OUT 12 (out), OUT 13 (out), OUT 14 (out), OUT 15 (out), OUT 16 (out), OUT 17 (out), OUT 18 (out), OUT 19 (out), OUT 20 (out), OUT 21 (out), OUT 22 (out), OUT 23 (out), OUT 24 (out), OUT 25 (out), OUT 26 (out), OUT 27 (out), OUT 28 (out), OUT 29 (out), OUT 30 (out), OUT 31 (out), OUT 32 (out), OUT 33 (out), OUT 34 (out), OUT 35 (out), OUT 36 (out), OUT 37 (out), OUT 38 (out), OUT 39 (out), OUT 40 (out), OUT 41 (out), OUT 42 (out), OUT 43 (out), OUT 44 (out), OUT 45 (out), OUT 46 (out), OUT 47 (out), OUT 48 (out), OUT 49 (out), OUT 50 (out), OUT 51 (out), OUT 52 (out), OUT 53 (out), OUT 54 (out), OUT 55 (out), OUT 56 (out), OUT 57 (out), OUT 58 (out), OUT 59 (out), OUT 60 (out), OUT 61 (out), OUT 62 (out), OUT 63 (out), OUT 64 (out), OUT 65 (out), OUT 66 (out), OUT 67 (out), OUT 68 (out), OUT 69 (out), OUT 70 (out), OUT 71 (out), OUT 72 (out), OUT 73 (out), OUT 74 (out), OUT 75 (out), OUT 76 (out), OUT 77 (out), OUT 78 (out), OUT 79 (out), OUT 80 (out), OUT 81 (out), OUT 82 (out), OUT 83 (out), OUT 84 (out), OUT 85 (out), OUT 86 (out), OUT 87 (out), OUT 88 (out), OUT 89 (out), OUT 90 (out), OUT 91 (out), OUT 92 (out), OUT 93 (out), OUT 94 (out), OUT 95 (out), OUT 96 (out), Port 1 (in), Port 2 (in), Port 3 (in), Port 4 (in), Port 5 (in), Port 6 (in), Port 7 (in), Port 8 (in), Port 9 (in), Port 10 (in), Port 11 (in), Port 12 (in), Port 13 (in), Port 14 (in), Port 15 (in), Port 16 (in), Port 17 (in), Port 18 (in), Port 19 (in), Port 20 (in), Port 21 (in), Port 22 (in), Port 23 (in), Port 24 (in), Port 25 (in), Port 26 (in), Port 27 (in), Port 28 (in), Port 29 (in), Port 30 (in), Port 31 (in), Port 32 (in), Port 33 (in), Port 34 (in), Port 35 (in), Port 36 (in), Port 37 (in), Port 38 (in), Port 39 (in), Port 40 (in), Port 41 (in), Port 42 (in), Port 43 (in), Port 44 (in), Port 45 (in), Port 46 (in), Port 47 (in), Port 48 (in), Port 49 (in), Port 50 (in), Port 51 (in), Port 52 (in), Port 53 (in), Port 54 (in), Port 55 (in), Port 56 (in), Port 57 (in), Port 58 (in), Port 59 (in), Port 60 (in), Port 61 (in), Port 62 (in), Port 63 (in), Port 64 (in), Port 65 (in), Port 66 (in), Port 67 (in), Port 68 (in), Port 69 (in), Port 70 (in), Port 71 (in), Port 72 (in), Port 73 (in), Port 74 (in), Port 75 (in), Port 76 (in), Port 77 (in), Port 78 (in), Port 79 (in), Port 80 (in), Port 81 (in), Port 82 (in), Port 83 (in), Port 84 (in), Port 85 (in), Port 86 (in), Port 87 (in), Port 88 (in), Port 89 (in), Port 90 (in), Port 91 (in), Port 92 (in), Port 93 (in), Port 94 (in), Port 95 (in), Port 96 (in)

### Nets
NetDD14_3: X4.5(OUT_5) ; port OUT 5
NetDD14_4: X4.6(OUT_6) ; port OUT 6
NetDD14_5: X4.7(OUT_7) ; port OUT 7
NetDD14_6: X4.8(OUT_8) ; port OUT 8
NetDD14_11: X4.1(OUT_1) ; port OUT 1
NetDD14_12: X4.2(OUT_2) ; port OUT 2
NetDD14_13: X4.3(OUT_3) ; port OUT 3
NetDD14_14: X4.4(OUT_4) ; port OUT 4
NetDD15_3: X4.13(OUT_13) ; port OUT 13
NetDD15_4: X4.14(OUT_14) ; port OUT 14
NetDD15_5: X4.15(OUT_15) ; port OUT 15
NetDD15_6: X4.16(OUT_16) ; port OUT 16
NetDD15_11: X4.9(OUT_9) ; port OUT 9
NetDD15_12: X4.10(OUT_10) ; port OUT 10
NetDD15_13: X4.11(OUT_11) ; port OUT 11
NetDD15_14: X4.12(OUT_12) ; port OUT 12
NetDD16_3: X4.21(OUT_21) ; port OUT 21
NetDD16_4: X4.22(OUT_22) ; port OUT 22
NetDD16_5: X4.23(OUT_23) ; port OUT 23
NetDD16_6: X4.24(OUT_24) ; port OUT 24
NetDD16_11: X4.17(OUT_17) ; port OUT 17
NetDD16_12: X4.18(OUT_18) ; port OUT 18
NetDD16_13: X4.19(OUT_19) ; port OUT 19
NetDD16_14: X4.20(OUT_20) ; port OUT 20
NetDD17_3: X4.29(OUT_29) ; port OUT 29
NetDD17_4: X4.30(OUT_30) ; port OUT 30
NetDD17_5: X4.31(OUT_31) ; port OUT 31
NetDD17_6: X4.32(OUT_32) ; port OUT 32
NetDD17_11: X4.25(OUT_25) ; port OUT 25
NetDD17_12: X4.26(OUT_26) ; port OUT 26
NetDD17_13: X4.27(OUT_27) ; port OUT 27
NetDD17_14: X4.28(OUT_28) ; port OUT 28
NetDD18_3: X4.37(OUT_37) ; port OUT 37
NetDD18_4: X4.38(OUT_38) ; port OUT 38
NetDD18_5: X4.39(OUT_39) ; port OUT 39
NetDD18_6: X4.40(OUT_40) ; port OUT 40
NetDD18_11: X4.33(OUT_33) ; port OUT 33
NetDD18_12: X4.34(OUT_34) ; port OUT 34
NetDD18_13: X4.35(OUT_35) ; port OUT 35
NetDD18_14: X4.36(OUT_36) ; port OUT 36
NetDD19_3: X5.5(OUT_5) ; port OUT 45
NetDD19_4: X5.6(OUT_6) ; port OUT 46
NetDD19_5: X5.7(OUT_7) ; port OUT 47
NetDD19_6: X5.8(OUT_8) ; port OUT 48
NetDD19_11: X5.1(OUT_1) ; port OUT 41
NetDD19_12: X5.2(OUT_2) ; port OUT 42
NetDD19_13: X5.3(OUT_3) ; port OUT 43
NetDD19_14: X5.4(OUT_4) ; port OUT 44
NetDD20_3: X5.13(OUT_13) ; port OUT 53
NetDD20_4: X5.14(OUT_14) ; port OUT 54
NetDD20_5: X5.15(OUT_15) ; port OUT 55
NetDD20_6: X5.16(OUT_16) ; port OUT 56
NetDD20_11: X5.9(OUT_9) ; port OUT 49
NetDD20_12: X5.10(OUT_10) ; port OUT 50
NetDD20_13: X5.11(OUT_11) ; port OUT 51
NetDD20_14: X5.12(OUT_12) ; port OUT 52
NetDD21_3: X5.21(OUT_21) ; port OUT 61
NetDD21_4: X5.22(OUT_22) ; port OUT 62
NetDD21_5: X5.23(OUT_23) ; port OUT 63
NetDD21_6: X5.24(OUT_24) ; port OUT 64
NetDD21_11: X5.17(OUT_17) ; port OUT 57
NetDD21_12: X5.18(OUT_18) ; port OUT 58
NetDD21_13: X5.19(OUT_19) ; port OUT 59
NetDD21_14: X5.20(OUT_20) ; port OUT 60
NetDD22_3: X5.29(OUT_29) ; port OUT 69
NetDD22_4: X5.30(OUT_30) ; port OUT 70
NetDD22_5: X5.31(OUT_31) ; port OUT 71
NetDD22_6: X5.32(OUT_32) ; port OUT 72
NetDD22_11: X5.25(OUT_25) ; port OUT 65
NetDD22_12: X5.26(OUT_26) ; port OUT 66
NetDD22_13: X5.27(OUT_27) ; port OUT 67
NetDD22_14: X5.28(OUT_28) ; port OUT 68
NetDD23_3: X5.37(OUT_37) ; port OUT 77
NetDD23_4: X5.38(OUT_38) ; port OUT 78
NetDD23_5: X5.39(OUT_39) ; port OUT 79
NetDD23_6: X5.40(OUT_40) ; port OUT 80
NetDD23_11: X5.33(OUT_33) ; port OUT 73
NetDD23_12: X5.34(OUT_34) ; port OUT 74
NetDD23_13: X5.35(OUT_35) ; port OUT 75
NetDD23_14: X5.36(OUT_36) ; port OUT 76
NetDD24_3: X6.5(OUT_5) ; port OUT 85
NetDD24_4: X6.6(OUT_6) ; port OUT 86
NetDD24_5: X6.7(OUT_7) ; port OUT 87
NetDD24_6: X6.8(OUT_8) ; port OUT 88
NetDD24_11: X6.1(OUT_1) ; port OUT 81
NetDD24_12: X6.2(OUT_2) ; port OUT 82
NetDD24_13: X6.3(OUT_3) ; port OUT 83
NetDD24_14: X6.4(OUT_4) ; port OUT 84
NetDD25_3: X6.13(OUT_13) ; port OUT 93
NetDD25_4: X6.14(OUT_14) ; port OUT 94
NetDD25_5: X6.15(OUT_15) ; port OUT 95
NetDD25_6: X6.16(OUT_16) ; port OUT 96
NetDD25_11: X6.9(OUT_9) ; port OUT 89
NetDD25_12: X6.10(OUT_10) ; port OUT 90
NetDD25_13: X6.11(OUT_11) ; port OUT 91
NetDD25_14: X6.12(OUT_12) ; port OUT 92
NetR217_2: X1.1(IN_1) ; port Port 1
NetR218_2: X1.2(IN_2) ; port Port 2
NetR219_2: X1.3(IN_3) ; port Port 3
NetR220_2: X1.4(IN_4) ; port Port 4
NetR221_2: X1.5(IN_5) ; port Port 5
NetR222_2: X1.6(IN_6) ; port Port 6
NetR223_2: X1.7(IN_7) ; port Port 7
NetR224_2: X1.8(IN_8) ; port Port 8
NetR225_2: X1.9(IN_9) ; port Port 9
NetR226_2: X1.10(IN_10) ; port Port 10
NetR227_2: X1.11(IN_11) ; port Port 11
NetR228_2: X1.12(IN_12) ; port Port 12
NetR229_2: X1.13(IN_13) ; port Port 13
NetR230_2: X1.14(IN_14) ; port Port 14
NetR231_2: X1.15(IN_15) ; port Port 15
NetR232_2: X1.16(IN_16) ; port Port 16
NetR233_2: X1.17(IN_17) ; port Port 17
NetR234_2: X1.18(IN_18) ; port Port 18
NetR235_2: X1.19(IN_19) ; port Port 19
NetR236_2: X1.20(IN_20) ; port Port 20
NetR237_2: X1.21(IN_21) ; port Port 21
NetR238_2: X1.22(IN_22) ; port Port 22
NetR239_2: X1.23(IN_23) ; port Port 23
NetR240_2: X1.24(IN_24) ; port Port 24
NetR241_2: X1.25(IN_25) ; port Port 25
NetR242_2: X1.26(IN_26) ; port Port 26
NetR243_2: X1.27(IN_27) ; port Port 27
NetR244_2: X1.28(IN_28) ; port Port 28
NetR245_2: X1.29(IN_29) ; port Port 29
NetR246_2: X1.30(IN_30) ; port Port 30
NetR247_2: X1.31(IN_31) ; port Port 31
NetR248_2: X1.32(IN_32) ; port Port 32
NetR249_2: X1.33(IN_33) ; port Port 33
NetR250_2: X1.34(IN_34) ; port Port 34
NetR251_2: X1.35(IN_35) ; port Port 35
NetR252_2: X1.36(IN_36) ; port Port 36
NetR253_2: X1.37(IN_37) ; port Port 37
NetR254_2: X1.38(IN_38) ; port Port 38
NetR255_2: X1.39(IN_39) ; port Port 39
NetR256_2: X1.40(IN_40) ; port Port 40
NetR257_2: X2.1(IN_1) ; port Port 41
NetR258_2: X2.2(IN_2) ; port Port 42
NetR259_2: X2.3(IN_3) ; port Port 43
NetR260_2: X2.4(IN_4) ; port Port 44
NetR261_2: X2.5(IN_5) ; port Port 45
NetR262_2: X2.6(IN_6) ; port Port 46
NetR263_2: X2.7(IN_7) ; port Port 47
NetR264_2: X2.8(IN_8) ; port Port 48
NetR265_2: X2.9(IN_9) ; port Port 49
NetR266_2: X2.10(IN_10) ; port Port 50
NetR267_2: X2.11(IN_11) ; port Port 51
NetR268_2: X2.12(IN_12) ; port Port 52
NetR269_2: X2.13(IN_13) ; port Port 53
NetR270_2: X2.14(IN_14) ; port Port 54
NetR271_2: X2.15(IN_15) ; port Port 55
NetR272_2: X2.16(IN_16) ; port Port 56
NetR273_2: X2.17(IN_17) ; port Port 57
NetR274_2: X2.18(IN_18) ; port Port 58
NetR275_2: X2.19(IN_19) ; port Port 59
NetR276_2: X2.20(IN_20) ; port Port 60
NetR277_2: X2.21(IN_21) ; port Port 61
NetR278_2: X2.22(IN_22) ; port Port 62
NetR279_2: X2.23(IN_23) ; port Port 63
NetR280_2: X2.24(IN_24) ; port Port 64
NetR281_2: X2.25(IN_25) ; port Port 65
NetR282_2: X2.26(IN_26) ; port Port 66
NetR283_2: X2.27(IN_27) ; port Port 67
NetR284_2: X2.28(IN_28) ; port Port 68
NetR285_2: X2.29(IN_29) ; port Port 69
NetR286_2: X2.30(IN_30) ; port Port 70
NetR287_2: X2.31(IN_31) ; port Port 71
NetR288_2: X2.32(IN_32) ; port Port 72
NetR289_2: X2.33(IN_33) ; port Port 73
NetR290_2: X2.34(IN_34) ; port Port 74
NetR291_2: X2.35(IN_35) ; port Port 75
NetR292_2: X2.36(IN_36) ; port Port 76
NetR293_2: X2.37(IN_37) ; port Port 77
NetR294_2: X2.38(IN_38) ; port Port 78
NetR295_2: X2.39(IN_39) ; port Port 79
NetR296_2: X2.40(IN_40) ; port Port 80
NetR297_2: X3.1(IN_1) ; port Port 81
NetR298_2: X3.2(IN_2) ; port Port 82
NetR299_2: X3.3(IN_3) ; port Port 83
NetR300_2: X3.4(IN_4) ; port Port 84
NetR301_2: X3.5(IN_5) ; port Port 85
NetR302_2: X3.6(IN_6) ; port Port 86
NetR303_2: X3.7(IN_7) ; port Port 87
NetR304_2: X3.8(IN_8) ; port Port 88
NetR305_2: X3.9(IN_9) ; port Port 89
NetR306_2: X3.10(IN_10) ; port Port 90
NetR307_2: X3.11(IN_11) ; port Port 91
NetR308_2: X3.12(IN_12) ; port Port 92
NetR309_2: X3.13(IN_13) ; port Port 93
NetR310_2: X3.14(IN_14) ; port Port 94
NetR311_2: X3.15(IN_15) ; port Port 95
NetR312_2: X3.16(IN_16) ; port Port 96

### Library data of the parts
X1 X2 = PLD-40: Part Number: DS1021-2x20; Added by: viskov2055@gmail.com; Mount_Type: THM; Solder_Amount: 40; Created at: 13/02/2024; Mount: MOUNT; Pkg: PLD-40
X3 = PLD-16: Part Number: DS1021-2x8; Added by: viskov2055@gmail.com; Mount_Type: THM; Solder_Amount: 16; Created at: 13/02/2024; Mount: MOUNT; Pkg: PLD-16
X4 X5 = PLD-40 out: Part Number: DS1021-2x20; Added by: viskov2055@gmail.com; Mount_Type: THM; Solder_Amount: 40; Created at: 16/02/2024; Mount: MOUNT; Pkg: PLD-40
X6 = PLD-16 out: Part Number: DS1021-2x8; Added by: viskov2055@gmail.com; Mount_Type: THM; Solder_Amount: 16; Created at: 16/02/2024; Mount: MOUNT; Pkg: PLD-16

## Sheet IDC_Tester_v1_LED.SchDoc
size 420 x 297 mm; SheetNumber: 4; SheetTotal: 10
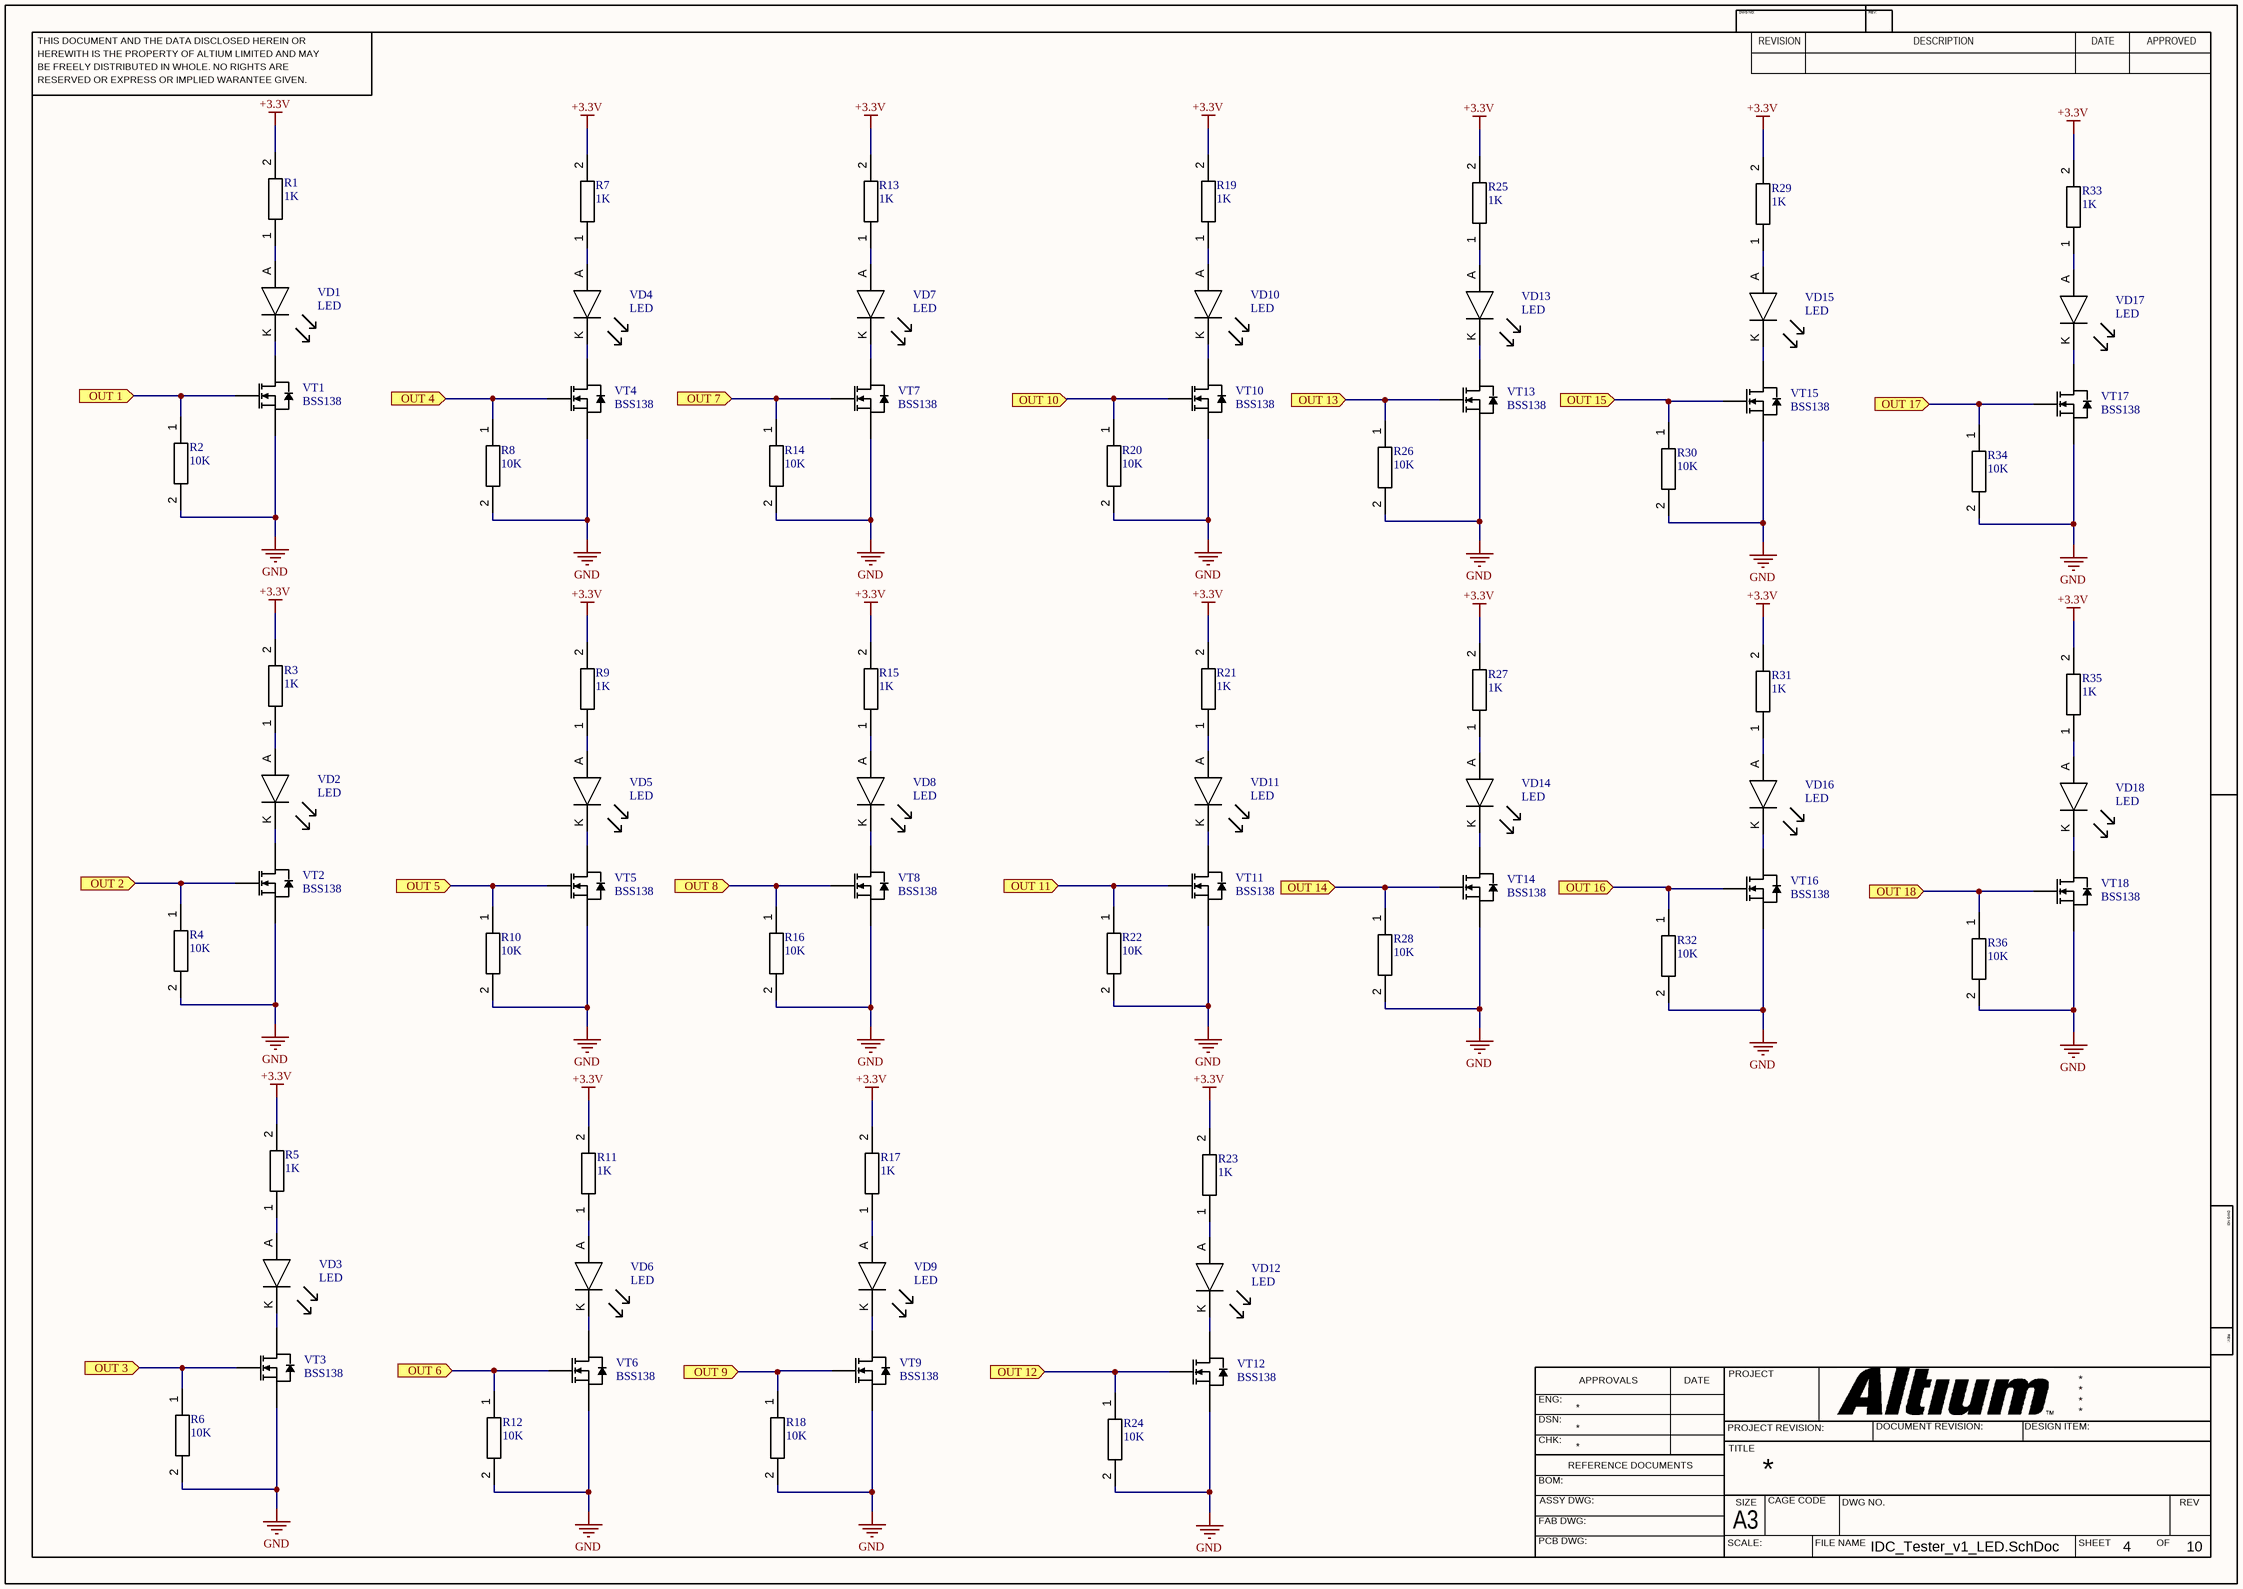
[diagram p3: IDC_Tester_v1_LED.SchDoc]

### Parts
R1  1K  [Resistor 0603]
R2  10K  [Resistor 0603]
R3  1K  [Resistor 0603]
R4  10K  [Resistor 0603]
R5  1K  [Resistor 0603]
R6  10K  [Resistor 0603]
R7  1K  [Resistor 0603]
R8  10K  [Resistor 0603]
R9  1K  [Resistor 0603]
R10  10K  [Resistor 0603]
R11  1K  [Resistor 0603]
R12  10K  [Resistor 0603]
R13  1K  [Resistor 0603]
R14  10K  [Resistor 0603]
R15  1K  [Resistor 0603]
R16  10K  [Resistor 0603]
R17  1K  [Resistor 0603]
R18  10K  [Resistor 0603]
R19  1K  [Resistor 0603]
R20  10K  [Resistor 0603]
R21  1K  [Resistor 0603]
R22  10K  [Resistor 0603]
R23  1K  [Resistor 0603]
R24  10K  [Resistor 0603]
R25  1K  [Resistor 0603]
R26  10K  [Resistor 0603]
R27  1K  [Resistor 0603]
R28  10K  [Resistor 0603]
R29  1K  [Resistor 0603]
R30  10K  [Resistor 0603]
R31  1K  [Resistor 0603]
R32  10K  [Resistor 0603]
R33  1K  [Resistor 0603]
R34  10K  [Resistor 0603]
R35  1K  [Resistor 0603]
R36  10K  [Resistor 0603]
VD1  LED  [Led 0603 - duplicate]
VD2  LED  [Led 0603 - duplicate]
VD3  LED  [Led 0603 - duplicate]
VD4  LED  [Led 0603 - duplicate]
VD5  LED  [Led 0603 - duplicate]
VD6  LED  [Led 0603 - duplicate]
VD7  LED  [Led 0603 - duplicate]
VD8  LED  [Led 0603 - duplicate]
VD9  LED  [Led 0603 - duplicate]
VD10  LED  [Led 0603 - duplicate]
VD11  LED  [Led 0603 - duplicate]
VD12  LED  [Led 0603 - duplicate]
VD13  LED  [Led 0603 - duplicate]
VD14  LED  [Led 0603 - duplicate]
VD15  LED  [Led 0603 - duplicate]
VD16  LED  [Led 0603 - duplicate]
VD17  LED  [Led 0603 - duplicate]
VD18  LED  [Led 0603 - duplicate]
VT1  BSS138  [SOT-23-3]
VT2  BSS138  [SOT-23-3]
VT3  BSS138  [SOT-23-3]
VT4  BSS138  [SOT-23-3]
VT5  BSS138  [SOT-23-3]
VT6  BSS138  [SOT-23-3]
VT7  BSS138  [SOT-23-3]
VT8  BSS138  [SOT-23-3]
VT9  BSS138  [SOT-23-3]
VT10  BSS138  [SOT-23-3]
VT11  BSS138  [SOT-23-3]
VT12  BSS138  [SOT-23-3]
VT13  BSS138  [SOT-23-3]
VT14  BSS138  [SOT-23-3]
VT15  BSS138  [SOT-23-3]
VT16  BSS138  [SOT-23-3]
VT17  BSS138  [SOT-23-3]
VT18  BSS138  [SOT-23-3]

### Ports
OUT 1 (in), OUT 2 (in), OUT 3 (in), OUT 4 (in), OUT 5 (in), OUT 6 (in), OUT 7 (in), OUT 8 (in), OUT 9 (in), OUT 10 (in), OUT 11 (in), OUT 12 (in), OUT 13 (in), OUT 14 (in), OUT 15 (in), OUT 16 (in), OUT 17 (in), OUT 18 (in)

### Nets
+3.3V: R1.2 R3.2 R5.2 R7.2 R9.2 R11.2 R13.2 R15.2 R17.2 R19.2 R21.2 R23.2 R25.2 R27.2 R29.2 R31.2 R33.2 R35.2
GND: R2.2 R4.2 R6.2 R8.2 R10.2 R12.2 R14.2 R16.2 R18.2 R20.2 R22.2 R24.2 R26.2 R28.2 R30.2 R32.2 R34.2 R36.2 VT1.2(S) VT2.2(S) VT3.2(S) VT4.2(S) VT5.2(S) VT6.2(S) VT7.2(S) VT8.2(S) VT9.2(S) VT10.2(S) VT11.2(S) VT12.2(S) VT13.2(S) VT14.2(S) VT15.2(S) VT16.2(S) VT17.2(S) VT18.2(S)
NetDD14_3: R10.1 VT5.1(G) ; port OUT 5
NetDD14_4: R12.1 VT6.1(G) ; port OUT 6
NetDD14_5: R14.1 VT7.1(G) ; port OUT 7
NetDD14_6: R16.1 VT8.1(G) ; port OUT 8
NetDD14_11: R2.1 VT1.1(G) ; port OUT 1
NetDD14_12: R4.1 VT2.1(G) ; port OUT 2
NetDD14_13: R6.1 VT3.1(G) ; port OUT 3
NetDD14_14: R8.1 VT4.1(G) ; port OUT 4
NetDD15_3: R26.1 VT13.1(G) ; port OUT 13
NetDD15_4: R28.1 VT14.1(G) ; port OUT 14
NetDD15_5: R30.1 VT15.1(G) ; port OUT 15
NetDD15_6: R32.1 VT16.1(G) ; port OUT 16
NetDD15_11: R18.1 VT9.1(G) ; port OUT 9
NetDD15_12: R20.1 VT10.1(G) ; port OUT 10
NetDD15_13: R22.1 VT11.1(G) ; port OUT 11
NetDD15_14: R24.1 VT12.1(G) ; port OUT 12
NetDD16_11: R34.1 VT17.1(G) ; port OUT 17
NetDD16_12: R36.1 VT18.1(G) ; port OUT 18
NetR1_1: R1.1 VD1.A
NetR3_1: R3.1 VD2.A
NetR5_1: R5.1 VD3.A
NetR7_1: R7.1 VD4.A
NetR9_1: R9.1 VD5.A
NetR11_1: R11.1 VD6.A
NetR13_1: R13.1 VD7.A
NetR15_1: R15.1 VD8.A
NetR17_1: R17.1 VD9.A
NetR19_1: R19.1 VD10.A
NetR21_1: R21.1 VD11.A
NetR23_1: R23.1 VD12.A
NetR25_1: R25.1 VD13.A
NetR27_1: R27.1 VD14.A
NetR29_1: R29.1 VD15.A
NetR31_1: R31.1 VD16.A
NetR33_1: R33.1 VD17.A
NetR35_1: R35.1 VD18.A
NetVD1_K: VD1.K VT1.3(D)
NetVD2_K: VD2.K VT2.3(D)
NetVD3_K: VD3.K VT3.3(D)
NetVD4_K: VD4.K VT4.3(D)
NetVD5_K: VD5.K VT5.3(D)
NetVD6_K: VD6.K VT6.3(D)
NetVD7_K: VD7.K VT7.3(D)
NetVD8_K: VD8.K VT8.3(D)
NetVD9_K: VD9.K VT9.3(D)
NetVD10_K: VD10.K VT10.3(D)
NetVD11_K: VD11.K VT11.3(D)
NetVD12_K: VD12.K VT12.3(D)
NetVD13_K: VD13.K VT13.3(D)
NetVD14_K: VD14.K VT14.3(D)
NetVD15_K: VD15.K VT15.3(D)
NetVD16_K: VD16.K VT16.3(D)
NetVD17_K: VD17.K VT17.3(D)
NetVD18_K: VD18.K VT18.3(D)

### Notes on the sheet
- THIS DOCUMENT AND THE DATA DISCLOSED HEREIN OR
- HEREWITH IS THE PROPERTY OF ALTIUM LIMITED AND MAY
- DWG NO:
- REVISION
- REV:
- DESCRIPTION
- DATE
- APPROVED
- BE FREELY DISTRIBUTED IN WHOLE. NO RIGHTS ARE
- RESERVED OR EXPRESS OR IMPLIED WARANTEE GIVEN.
- ENG:
- APPROVALS
- PROJECT
- DSN:
- CHK:
- REFERENCE DOCUMENTS
- PROJECT REVISION:
- TITLE
- DOCUMENT REVISION:
- DESIGN ITEM:
- BOM:
- FAB DWG:
- PCB DWG:
- ASSY DWG:
- SCALE:
- A3
- SIZE
- CAGE CODE
- FILE NAME
- DWG NO.
- SHEET
- OF
- REV

### Library data of the parts
R1 R3 R5 R7 R9 R11 R13 R15 R17 R19 R21 R23 R25 R27 R29 R31 R33 R35 = Resistor 1K: as R313 on sheet IDC_Tester_v1_mcu; Created at: 13/02/2024; Mount: MOUNT
R2 R4 R6 R8 R10 R12 R14 R16 R18 R20 R22 R24 R26 R28 R30 R32 R34 R36 = Resistor 10K: as R318 on sheet IDC_Tester_v1_mcu; Created at: 15/02/2024; Mount: MOUNT
VD1-VD18 = LED: as VD97 on sheet IDC_Tester_v1_mcu; RoHS: Yes; Category: LEDs; Stock 1: 44996; Pricing 1: 1=0,6, 10=0,368, 100=0,2114, 1000=0,16544, 2000=0,15165 (USD); MountType: SMD; Case/Package: 0603; Color: Green; Case Code (Imperial): 0603; Case Code (Metric): 1608; Packaging: Tape and Reel; Length: 1.6mm; Width: 0.8mm; Height: 0.28mm; RoHS Compliant: Yes; ComponentLink1URL: https://datasheet.octopart.com/APG1608ZGCK-Kingbright-datasheet-153682089.pdf?src-supplier=Future+Electronics; ComponentLink1Description: https://datasheet.octopart.com/APG1608ZGCK-Kingbright-datasheet-153682089.pdf?src-supplier=Future+Electronics; ComponentLink2URL: http://www.kingbrightusa.com/images/catalog/SPEC/APG1608ZGCK.pdf?src-supplier=Digikey; ComponentLink2Description: http://www.kingbrightusa.com/images/catalog/SPEC/APG1608ZGCK.pdf?src-supplier=Digikey; ComponentLink3URL: https://datasheet.octopart.com/APG1608ZGCK-Kingbright-datasheet-137408059.pdf?src-supplier=Sager+Electronics; ComponentLink3Description: https://datasheet.octopart.com/APG1608ZGCK-Kingbright-datasheet-137408059.pdf?src-supplier=Sager+Electronics; Supplier Part Number 1: 754-2113-1-ND; Created at: 13/02/2024; Mount: MOUNT; Part Number: APG1608ZGCK; Supplier 1: Digikey
VT1-VT18 = BSS138: N-Channel Logic Level Enhancement Mode Field Effect Transistor; Solder_Amount: 3; Added_by: ma_lubushkin@teslatec.ru; Pkg: SOT-23; Part Number: BSS138; Mount: MOUNT; MountType: SMD; Created_at: 03/12/2019

## Sheet IDC_Tester_v1_LED_2.SchDoc
size 420 x 297 mm; SheetNumber: 5; SheetTotal: 10
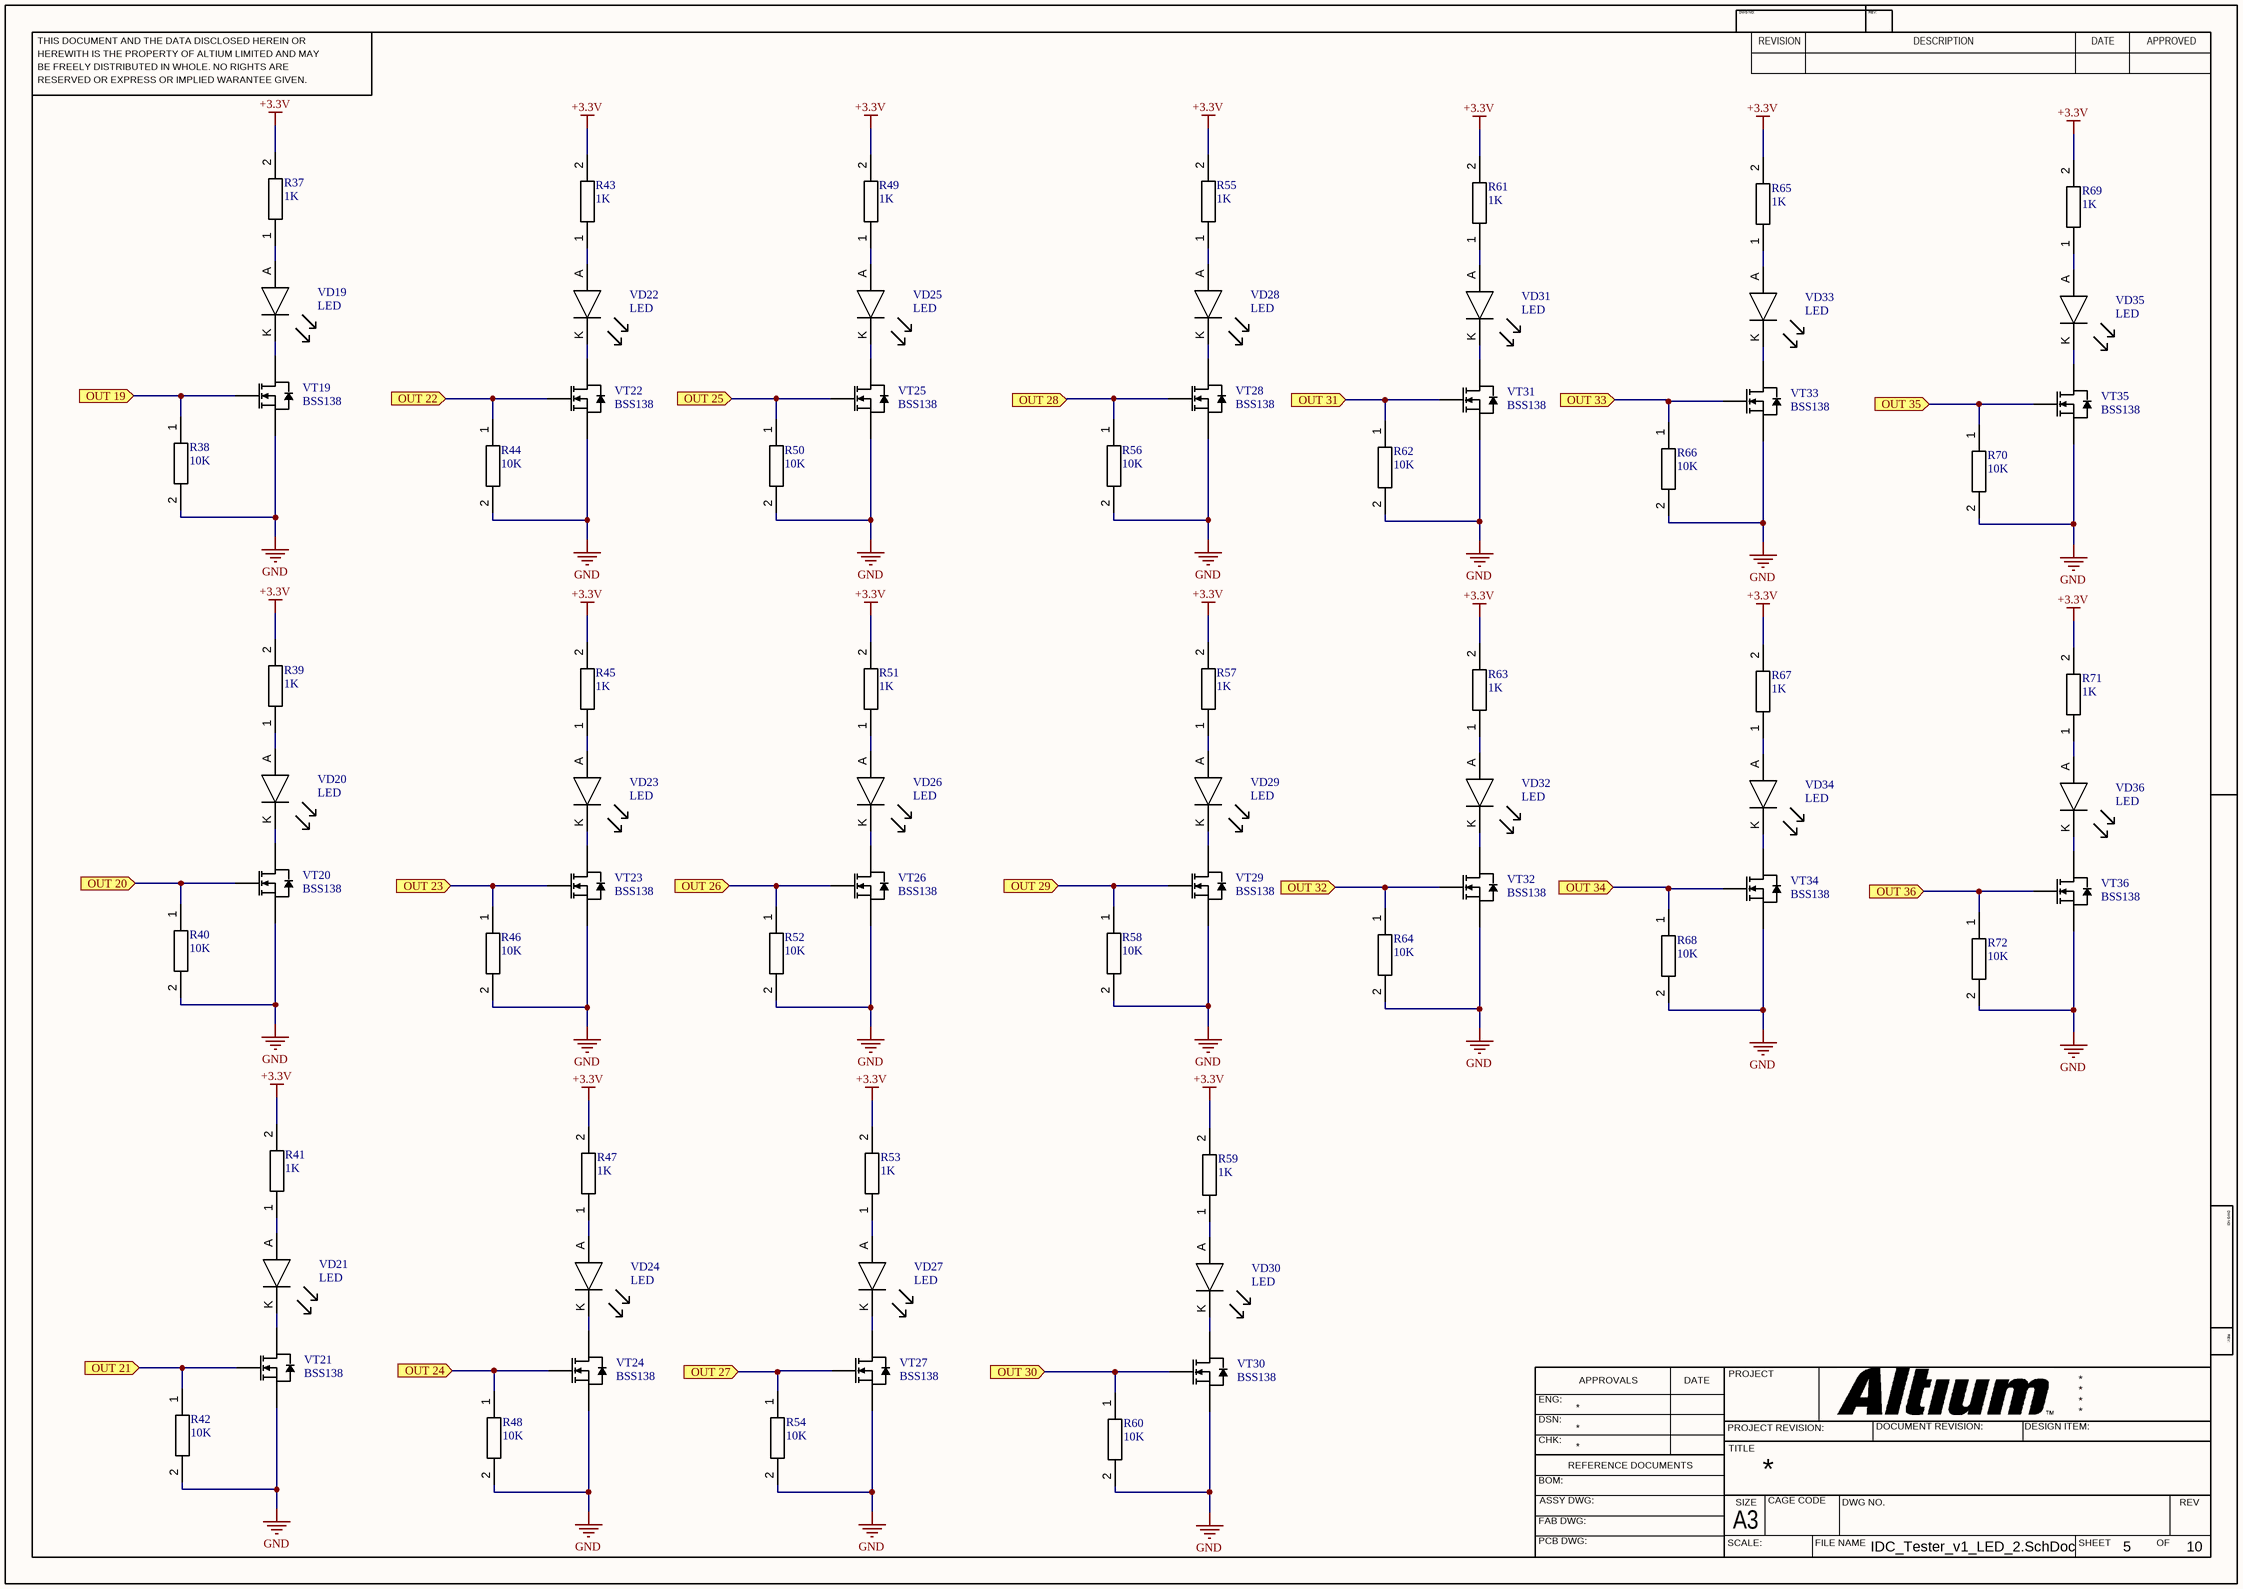
[diagram p4: IDC_Tester_v1_LED_2.SchDoc]

### Parts
R37  1K  [Resistor 0603]
R38  10K  [Resistor 0603]
R39  1K  [Resistor 0603]
R40  10K  [Resistor 0603]
R41  1K  [Resistor 0603]
R42  10K  [Resistor 0603]
R43  1K  [Resistor 0603]
R44  10K  [Resistor 0603]
R45  1K  [Resistor 0603]
R46  10K  [Resistor 0603]
R47  1K  [Resistor 0603]
R48  10K  [Resistor 0603]
R49  1K  [Resistor 0603]
R50  10K  [Resistor 0603]
R51  1K  [Resistor 0603]
R52  10K  [Resistor 0603]
R53  1K  [Resistor 0603]
R54  10K  [Resistor 0603]
R55  1K  [Resistor 0603]
R56  10K  [Resistor 0603]
R57  1K  [Resistor 0603]
R58  10K  [Resistor 0603]
R59  1K  [Resistor 0603]
R60  10K  [Resistor 0603]
R61  1K  [Resistor 0603]
R62  10K  [Resistor 0603]
R63  1K  [Resistor 0603]
R64  10K  [Resistor 0603]
R65  1K  [Resistor 0603]
R66  10K  [Resistor 0603]
R67  1K  [Resistor 0603]
R68  10K  [Resistor 0603]
R69  1K  [Resistor 0603]
R70  10K  [Resistor 0603]
R71  1K  [Resistor 0603]
R72  10K  [Resistor 0603]
VD19  LED  [Led 0603 - duplicate]
VD20  LED  [Led 0603 - duplicate]
VD21  LED  [Led 0603 - duplicate]
VD22  LED  [Led 0603 - duplicate]
VD23  LED  [Led 0603 - duplicate]
VD24  LED  [Led 0603 - duplicate]
VD25  LED  [Led 0603 - duplicate]
VD26  LED  [Led 0603 - duplicate]
VD27  LED  [Led 0603 - duplicate]
VD28  LED  [Led 0603 - duplicate]
VD29  LED  [Led 0603 - duplicate]
VD30  LED  [Led 0603 - duplicate]
VD31  LED  [Led 0603 - duplicate]
VD32  LED  [Led 0603 - duplicate]
VD33  LED  [Led 0603 - duplicate]
VD34  LED  [Led 0603 - duplicate]
VD35  LED  [Led 0603 - duplicate]
VD36  LED  [Led 0603 - duplicate]
VT19  BSS138  [SOT-23-3]
VT20  BSS138  [SOT-23-3]
VT21  BSS138  [SOT-23-3]
VT22  BSS138  [SOT-23-3]
VT23  BSS138  [SOT-23-3]
VT24  BSS138  [SOT-23-3]
VT25  BSS138  [SOT-23-3]
VT26  BSS138  [SOT-23-3]
VT27  BSS138  [SOT-23-3]
VT28  BSS138  [SOT-23-3]
VT29  BSS138  [SOT-23-3]
VT30  BSS138  [SOT-23-3]
VT31  BSS138  [SOT-23-3]
VT32  BSS138  [SOT-23-3]
VT33  BSS138  [SOT-23-3]
VT34  BSS138  [SOT-23-3]
VT35  BSS138  [SOT-23-3]
VT36  BSS138  [SOT-23-3]

### Ports
OUT 19 (in), OUT 20 (in), OUT 21 (in), OUT 22 (in), OUT 23 (in), OUT 24 (in), OUT 25 (in), OUT 26 (in), OUT 27 (in), OUT 28 (in), OUT 29 (in), OUT 30 (in), OUT 31 (in), OUT 32 (in), OUT 33 (in), OUT 34 (in), OUT 35 (in), OUT 36 (in)

### Nets
+3.3V: R37.2 R39.2 R41.2 R43.2 R45.2 R47.2 R49.2 R51.2 R53.2 R55.2 R57.2 R59.2 R61.2 R63.2 R65.2 R67.2 R69.2 R71.2
GND: R38.2 R40.2 R42.2 R44.2 R46.2 R48.2 R50.2 R52.2 R54.2 R56.2 R58.2 R60.2 R62.2 R64.2 R66.2 R68.2 R70.2 R72.2 VT19.2(S) VT20.2(S) VT21.2(S) VT22.2(S) VT23.2(S) VT24.2(S) VT25.2(S) VT26.2(S) VT27.2(S) VT28.2(S) VT29.2(S) VT30.2(S) VT31.2(S) VT32.2(S) VT33.2(S) VT34.2(S) VT35.2(S) VT36.2(S)
NetDD16_3: R42.1 VT21.1(G) ; port OUT 21
NetDD16_4: R44.1 VT22.1(G) ; port OUT 22
NetDD16_5: R46.1 VT23.1(G) ; port OUT 23
NetDD16_6: R48.1 VT24.1(G) ; port OUT 24
NetDD16_13: R38.1 VT19.1(G) ; port OUT 19
NetDD16_14: R40.1 VT20.1(G) ; port OUT 20
NetDD17_3: R58.1 VT29.1(G) ; port OUT 29
NetDD17_4: R60.1 VT30.1(G) ; port OUT 30
NetDD17_5: R62.1 VT31.1(G) ; port OUT 31
NetDD17_6: R64.1 VT32.1(G) ; port OUT 32
NetDD17_11: R50.1 VT25.1(G) ; port OUT 25
NetDD17_12: R52.1 VT26.1(G) ; port OUT 26
NetDD17_13: R54.1 VT27.1(G) ; port OUT 27
NetDD17_14: R56.1 VT28.1(G) ; port OUT 28
NetDD18_11: R66.1 VT33.1(G) ; port OUT 33
NetDD18_12: R68.1 VT34.1(G) ; port OUT 34
NetDD18_13: R70.1 VT35.1(G) ; port OUT 35
NetDD18_14: R72.1 VT36.1(G) ; port OUT 36
NetR37_1: R37.1 VD19.A
NetR39_1: R39.1 VD20.A
NetR41_1: R41.1 VD21.A
NetR43_1: R43.1 VD22.A
NetR45_1: R45.1 VD23.A
NetR47_1: R47.1 VD24.A
NetR49_1: R49.1 VD25.A
NetR51_1: R51.1 VD26.A
NetR53_1: R53.1 VD27.A
NetR55_1: R55.1 VD28.A
NetR57_1: R57.1 VD29.A
NetR59_1: R59.1 VD30.A
NetR61_1: R61.1 VD31.A
NetR63_1: R63.1 VD32.A
NetR65_1: R65.1 VD33.A
NetR67_1: R67.1 VD34.A
NetR69_1: R69.1 VD35.A
NetR71_1: R71.1 VD36.A
NetVD19_K: VD19.K VT19.3(D)
NetVD20_K: VD20.K VT20.3(D)
NetVD21_K: VD21.K VT21.3(D)
NetVD22_K: VD22.K VT22.3(D)
NetVD23_K: VD23.K VT23.3(D)
NetVD24_K: VD24.K VT24.3(D)
NetVD25_K: VD25.K VT25.3(D)
NetVD26_K: VD26.K VT26.3(D)
NetVD27_K: VD27.K VT27.3(D)
NetVD28_K: VD28.K VT28.3(D)
NetVD29_K: VD29.K VT29.3(D)
NetVD30_K: VD30.K VT30.3(D)
NetVD31_K: VD31.K VT31.3(D)
NetVD32_K: VD32.K VT32.3(D)
NetVD33_K: VD33.K VT33.3(D)
NetVD34_K: VD34.K VT34.3(D)
NetVD35_K: VD35.K VT35.3(D)
NetVD36_K: VD36.K VT36.3(D)

### Notes on the sheet
- THIS DOCUMENT AND THE DATA DISCLOSED HEREIN OR
- HEREWITH IS THE PROPERTY OF ALTIUM LIMITED AND MAY
- DWG NO:
- REVISION
- REV:
- DESCRIPTION
- DATE
- APPROVED
- BE FREELY DISTRIBUTED IN WHOLE. NO RIGHTS ARE
- RESERVED OR EXPRESS OR IMPLIED WARANTEE GIVEN.
- ENG:
- APPROVALS
- PROJECT
- DSN:
- CHK:
- REFERENCE DOCUMENTS
- PROJECT REVISION:
- TITLE
- DOCUMENT REVISION:
- DESIGN ITEM:
- BOM:
- FAB DWG:
- PCB DWG:
- ASSY DWG:
- SCALE:
- A3
- SIZE
- CAGE CODE
- FILE NAME
- DWG NO.
- SHEET
- OF
- REV

### Library data of the parts
R37 R39 R41 R43 R45 R47 R49 R51 R53 R55 R57 R59 R61 R63 R65 R67 R69 R71 = Resistor 1K: as R313 on sheet IDC_Tester_v1_mcu; Created at: 13/02/2024; Mount: MOUNT
R38 R40 R42 R44 R46 R48 R50 R52 R54 R56 R58 R60 R62 R64 R66 R68 R70 R72 = Resistor 10K: as R318 on sheet IDC_Tester_v1_mcu; Created at: 15/02/2024; Mount: MOUNT
VD19-VD36 = LED: as VD97 on sheet IDC_Tester_v1_mcu; RoHS: Yes; Category: LEDs; Stock 1: 44996; Pricing 1: 1=0,6, 10=0,368, 100=0,2114, 1000=0,16544, 2000=0,15165 (USD); MountType: SMD; Case/Package: 0603; Color: Green; Case Code (Imperial): 0603; Case Code (Metric): 1608; Packaging: Tape and Reel; Length: 1.6mm; Width: 0.8mm; Height: 0.28mm; RoHS Compliant: Yes; ComponentLink1URL: https://datasheet.octopart.com/APG1608ZGCK-Kingbright-datasheet-153682089.pdf?src-supplier=Future+Electronics; ComponentLink1Description: https://datasheet.octopart.com/APG1608ZGCK-Kingbright-datasheet-153682089.pdf?src-supplier=Future+Electronics; ComponentLink2URL: http://www.kingbrightusa.com/images/catalog/SPEC/APG1608ZGCK.pdf?src-supplier=Digikey; ComponentLink2Description: http://www.kingbrightusa.com/images/catalog/SPEC/APG1608ZGCK.pdf?src-supplier=Digikey; ComponentLink3URL: https://datasheet.octopart.com/APG1608ZGCK-Kingbright-datasheet-137408059.pdf?src-supplier=Sager+Electronics; ComponentLink3Description: https://datasheet.octopart.com/APG1608ZGCK-Kingbright-datasheet-137408059.pdf?src-supplier=Sager+Electronics; Supplier Part Number 1: 754-2113-1-ND; Created at: 13/02/2024; Mount: MOUNT; Part Number: APG1608ZGCK; Supplier 1: Digikey
VT19-VT36 = BSS138: as VT1 on sheet IDC_Tester_v1_LED; Part Number: BSS138; Mount: MOUNT; MountType: SMD; Created_at: 03/12/2019